# Altium project ADCS_CubeSat_1U.PrjPcb (part 1 of 2)
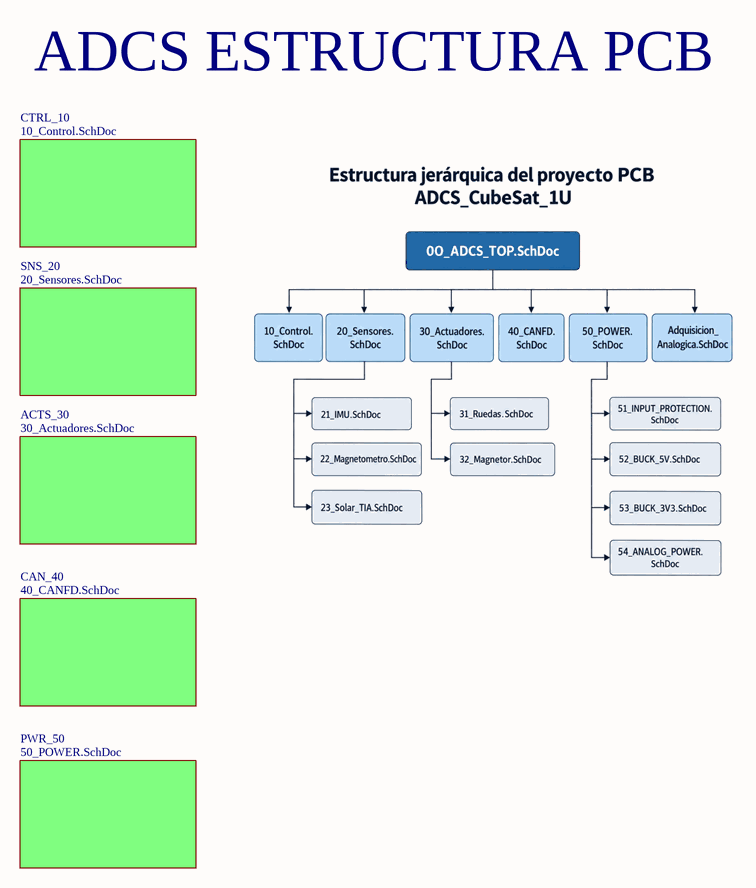
[diagram p0: 00_ADCS_TOP.SchDoc]
16 sheets, 151 parts. Net scope: flat (ports and power ports of the same name join across sheets).
Sheets:
  00_ADCS_TOP.SchDoc
    CTRL_10 = 10_Control.SchDoc
    SNS_20 = 20_Sensores.SchDoc
      SS21 = 21_IMU.SchDoc
      SS22 = 22_Magnetometro.SchDoc
      SS23 = 23_Solar_TIA.SchDoc
    ACTS_30 = 30_Actuadores.SchDoc
      ACTS31 = 31_Ruedas.SchDoc
      ACTS32 = 32_Magnetor.SchDoc
    CAN_40 = 40_CANFD.SchDoc
    PWR_50 = 50_POWER.SchDoc
      PWR51 = 51_INPUT_PROTECTION.SchDoc
      PWR52 = 52_BUCK_5V.SchDoc
      PWR53 = 53_BUCK_3V3.SchDoc
      PWR54 = 54_ANALOG_POWER.SchDoc
  Adquicision_Analogica.SchDoc

## Sheet 00_ADCS_TOP.SchDoc
size A4; SheetNumber: 1; SheetTotal: 16

### Sub-sheets
ACTS_30 = 30_Actuadores.SchDoc: no entries
CAN_40 = 40_CANFD.SchDoc: no entries
CTRL_10 = 10_Control.SchDoc: no entries
PWR_50 = 50_POWER.SchDoc: no entries
SNS_20 = 20_Sensores.SchDoc: no entries

### Notes on the sheet
- ADCS ESTRUCTURA PCB

## Sheet 10_Control.SchDoc
size A4; SheetNumber: 15; SheetTotal: 16
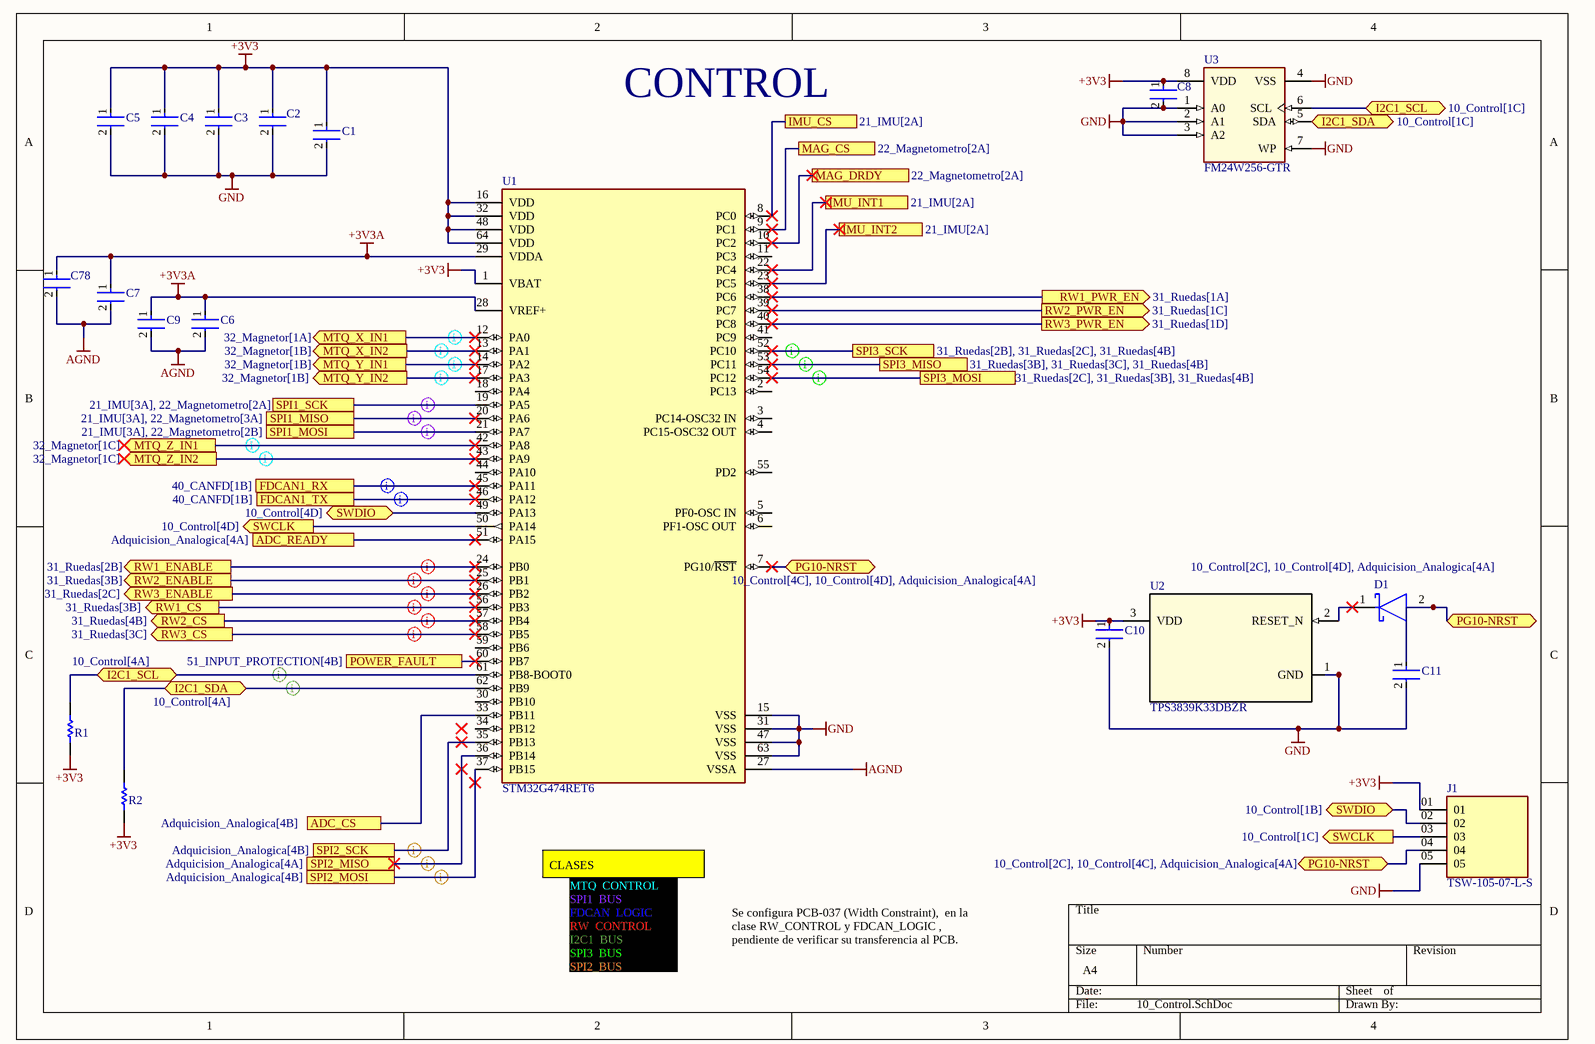
[diagram p1: 10_Control.SchDoc]

### Parts
C1  CC0603KRX7R7BB104  [FP-CC0603-DA-IPC_B]  (value not drawn)
C2  CC0603KRX7R7BB104  [FP-CC0603-DA-IPC_B]  (value not drawn)
C3  CC0603KRX7R7BB104  [FP-CC0603-DA-IPC_B]  (value not drawn)
C4  CC0603KRX7R7BB104  [FP-CC0603-DA-IPC_B]  (value not drawn)
C5  CC0805KKX7R6BB475  [FP-CC0805-0_85-IPC_C]  (value not drawn)
C6  CC0603KRX7R7BB104  [FP-CC0603-DA-IPC_B]  (value not drawn)
C7  CC0603KRX7R6BB105  [FP-CC0603-DA-IPC_B]  (value not drawn)
C8  CC0603KRX7R7BB104  [FP-CC0603-DA-IPC_B]  (value not drawn)
C9  CC0603KRX7R6BB105  [FP-CC0603-DA-IPC_B]  (value not drawn)
C10  CC0603KRX7R7BB104  [FP-CC0603-DA-IPC_B]  (value not drawn)
C11  CC0603KRX7R7BB104  [FP-CC0603-DA-IPC_B]  (value not drawn)
C78  C0603C103K3RACTU  [FP-C0603C-CF-IPC_B]  (value not drawn)
D1  BAT54J,115  [FP-SOD323F-MFG]  (value not drawn)
J1  TSW-105-07-L-S  [SAMTEC_TSW-105-07-L-S]
R1  RC0603FR-074K7L  [RESC1608X55X25NL10T15]  (value not drawn)
R2  RC0603FR-074K7L  [RESC1608X55X25NL10T15]  (value not drawn)
U1  STM32G474RET6  [FP-LQFP64-5W-IPC_C]
U2  TPS3839K33DBZR  [DBZ0003A_N]
U3  FM24W256-GTR  [SOIC127P602X173-8N-1-V]

### Ports
ADC_CS (see Adquicision_Analogica[4B]), ADC_READY (see Adquicision_Analogica[4A]), FDCAN1_RX (see 40_CANFD[1B]), FDCAN1_TX (see 40_CANFD[1B]), I2C1_SCL (bidir, see 10_Control[1C]), I2C1_SCL (bidir, see 10_Control[4A]), I2C1_SDA (bidir, see 10_Control[1C]), I2C1_SDA (bidir, see 10_Control[4A]), IMU_CS (see 21_IMU[2A]), IMU_INT1 (see 21_IMU[2A]), IMU_INT2 (see 21_IMU[2A]), MAG_CS (see 22_Magnetometro[2A]), MAG_DRDY (see 22_Magnetometro[2A]), MTQ_X_IN1 (out, see 32_Magnetor[1A]), MTQ_X_IN2 (out, see 32_Magnetor[1B]), MTQ_Y_IN1 (out, see 32_Magnetor[1B]), MTQ_Y_IN2 (out, see 32_Magnetor[1B]), MTQ_Z_IN1 (out, see 32_Magnetor[1C]), MTQ_Z_IN2 (out, see 32_Magnetor[1C]), PG10-NRST (bidir, see 10_Control[2C], 10_Control[4C], Adquicision_Analogica[4A]), PG10-NRST (bidir, see 10_Control[2C], 10_Control[4D], Adquicision_Analogica[4A]), PG10-NRST (bidir, see 10_Control[4C], 10_Control[4D], Adquicision_Analogica[4A]), POWER_FAULT (see 51_INPUT_PROTECTION[4B]), RW1_CS (out, see 31_Ruedas[3B]), RW1_ENABLE (out, see 31_Ruedas[2B]), RW1_PWR_EN (out, see 31_Ruedas[1A]), RW2_CS (out, see 31_Ruedas[4B]), RW2_ENABLE (out, see 31_Ruedas[3B]), RW2_PWR_EN (out, see 31_Ruedas[1C]), RW3_CS (out, see 31_Ruedas[3C]), RW3_ENABLE (out, see 31_Ruedas[2C]), RW3_PWR_EN (out, see 31_Ruedas[1D]), SPI1_MISO (see 21_IMU[3A], 22_Magnetometro[3A]), SPI1_MOSI (see 21_IMU[3A], 22_Magnetometro[2B]), SPI1_SCK (see 21_IMU[3A], 22_Magnetometro[2A]), SPI2_MISO (see Adquicision_Analogica[4A]), SPI2_MOSI (see Adquicision_Analogica[4B]), SPI2_SCK (see Adquicision_Analogica[4B]), SPI3_MISO (see 31_Ruedas[3B], 31_Ruedas[3C], 31_Ruedas[4B]), SPI3_MOSI (see 31_Ruedas[2C], 31_Ruedas[3B], 31_Ruedas[4B]), SPI3_SCK (see 31_Ruedas[2B], 31_Ruedas[2C], 31_Ruedas[4B]), SWCLK (out, see 10_Control[1C]), SWCLK (out, see 10_Control[4D]), SWDIO (bidir, see 10_Control[1B]), SWDIO (bidir, see 10_Control[4D])

### Nets
+3V3: C1.1 C2.1 C3.1 C4.1 C5.1 C8.1 C10.1 J1.01 R1.1 R2.1 U1.1(VBAT) U1.16(VDD) U1.32(VDD) U1.48(VDD) U1.64(VDD) U2.3(VDD) U3.8(VDD)
+3V3A: C6.1 C7.1 C9.1 C78.1 U1.28(VREF+) U1.29(VDDA)
AGND: C6.2 C7.2 C9.2 C78.2 U1.27(VSSA)
GND: C1.2 C2.2 C3.2 C4.2 C5.2 C8.2 C10.2 C11.2 J1.05 U1.15(VSS) U1.31(VSS) U1.47(VSS) U1.63(VSS) U2.1(GND) U3.1(A0) U3.2(A1) U3.3(A2) U3.4(VSS) U3.7(WP)
NetC11_1: C11.1 D1.2(A) J1.04 U1.7(PG10/~{RST}) ; port PG10-NRST
NetD1_1: D1.1(C) U2.2(RESET_N)
NetJ1_02: J1.02 U1.49(PA13) ; port SWDIO
NetJ1_03: J1.03 U1.50(PA14) ; port SWCLK
NetJ2_2: U1.24(PB0) ; port RW1_ENABLE
NetJ2_3: U1.53(PC11) ; port SPI3_MISO
NetJ2_4: U1.54(PC12) ; port SPI3_MOSI
NetJ2_5: U1.52(PC10) ; port SPI3_SCK
NetJ2_6: U1.56(PB3) ; port RW1_CS
NetJ3_2: U1.25(PB1) ; port RW2_ENABLE
NetJ3_6: U1.57(PB4) ; port RW2_CS
NetJ4_2: U1.26(PB2) ; port RW3_ENABLE
NetJ4_6: U1.58(PB5) ; port RW3_CS
NetR1_2: R1.2 U1.61(PB8-BOOT0) U3.6(SCL) ; port I2C1_SCL
NetR2_2: R2.2 U1.62(PB9) U3.5(SDA) ; port I2C1_SDA
NetR18_1: U1.38(PC6) ; port RW1_PWR_EN
NetR19_1: U1.39(PC7) ; port RW2_PWR_EN
NetR20_1: U1.40(PC8) ; port RW3_PWR_EN
NetR35_1: U1.60(PB7) ; port POWER_FAULT
NetU1_8: U1.8(PC0) ; port IMU_CS
NetU1_9: U1.9(PC1) ; port MAG_CS
NetU1_10: U1.10(PC2) ; port MAG_DRDY
NetU1_12: U1.12(PA0) ; port MTQ_X_IN1
NetU1_13: U1.13(PA1) ; port MTQ_X_IN2
NetU1_14: U1.14(PA2) ; port MTQ_Y_IN1
NetU1_17: U1.17(PA3) ; port MTQ_Y_IN2
NetU1_19: U1.19(PA5) ; port SPI1_SCK
NetU1_20: U1.20(PA6) ; port SPI1_MISO
NetU1_21: U1.21(PA7) ; port SPI1_MOSI
NetU1_22: U1.22(PC4) ; port IMU_INT1
NetU1_23: U1.23(PC5) ; port IMU_INT2
NetU1_33: U1.33(PB11) ; port ADC_CS
NetU1_35: U1.35(PB13) ; port SPI2_SCK
NetU1_36: U1.36(PB14) ; port SPI2_MISO
NetU1_37: U1.37(PB15) ; port SPI2_MOSI
NetU1_42: U1.42(PA8) ; port MTQ_Z_IN1
NetU1_43: U1.43(PA9) ; port MTQ_Z_IN2
NetU1_45: U1.45(PA11) ; port FDCAN1_RX
NetU1_46: U1.46(PA12) ; port FDCAN1_TX
NetU1_51: U1.51(PA15) ; port ADC_READY

Not connected (* = marked no-connect by the designer): U1 2(PC13) 3(PC14-OSC32_IN) 4(PC15-OSC32_OUT) 5(PF0-OSC_IN) 6(PF1-OSC_OUT) 11(PC3) 18(PA4) 30(PB10) 34(PB12) 41(PC9) 44(PA10) 55(PD2) 59(PB6)

### Layout directives
net class SPI3_BUS: NetJ2_3, NetJ2_4, NetJ2_5
net class RW_CONTROL; rule Width Constraint [Pref Width = 9.842mil    Min Width = 7.874mil    Max Width = 39.37mil]: NetJ2_2
net class RW_CONTROL: NetJ2_6, NetJ3_2, NetJ3_6, NetJ4_2, NetJ4_6
net class MTQ_CONTROL: NetU1_12, NetU1_13, NetU1_14, NetU1_17, NetU1_42, NetU1_43
net class SPI1_BUS: NetU1_19, NetU1_20, NetU1_21
net class SPI2_BUS: NetU1_35, NetU1_36, NetU1_37
net class FDCAN_LOGIC; rule Width Constraint [Pref Width = 9.842mil    Min Width = 7.874mil    Max Width = 39.37mil]: NetU1_45
net class FDCAN_LOGIC: NetU1_46
net class I2C1_BUS: NetR1_2, NetR2_2

### Notes on the sheet
- CONTROL
- CLASES
- MTQ_CONTROL
- SPI1_BUS
- FDCAN_LOGIC
- RW_CONTROL
- I2C1_BUS
- SPI3_BUS
- SPI2_BUS
- Se configura PCB-037 (Width Constraint),  en la clase RW_CONTROL y FDCAN_LOGIC , pendiente de verificar su transferencia al PCB.

### Library data of the parts
C1-C4 C6 C8 C10 C11 = CMP-2000-05002-2: CAP CER 0.1UF 16V X7R 0603; Manufacturer: YAGEO; Tolerance: 0.1; Value: 100 nF; Temperature Coefficient: 15%; Material: Ceramic; Voltage Rating: 16 V; Package: CC0603-DA; ComponentLink2Description: Datasheet; Octopart: https://octopart.com/cc0603krx7r7bb104-yageo-192941; Temperature Range High: +125°C; Digikey Description: CAP CER 0.1UF 16V X7R 0603; Voltage: 16 V; Device Class L2: Capacitors; Height: 0.9mm; Temperature: -55°C to +125°C; Manufacturer Part Number: CC0603KRX7R7BB104; Device Class L1: Passive Components; Device Class L3: Ceramic Capacitors; ComponentLink2URL: http://www.yageo.com/documents/recent/UPY-GPHC_X7R_6.3V-to-50V_18.pdf; Footprint Url: http://www.yageo.com/exep/pages/download/literatures/UPY-C_GEN_24.pdf; RoHS: TRUE; Temperature Range Low: -55°C; Temperature Characteristic: X7R; Lead Free: Yes; Capacitance: 100 nF; Category: Cap; Mouser Description: Multilayer Ceramic Capacitor, CC Series, 0.1 - F, - 10%, X7R, 16 V, 0603 [1608 Metric]; Automotive: No
C5 = CMP-03422-001180-1: CAP CER 4.7UF 10V X7R 0805; Manufacturer: Yageo; Tolerance: 0.1; Material: Ceramic; ComponentLink2Description: Datasheet; ComponentLink2URL: http://www.yageo.com/documents/recent/UPY-GPHC_Y5V_6.3V-to-50V_8.pdf; Capacitance: 4.7 uF; Mouser Description: 0805 4.7 uF 10 V ±10% Tolerance X7R SMT Multilayer Ceramic Capacitor; Automotive: No; Value: 4.7 uF; Height: 0.95mm; Temperature: -30°C to +85°C; Temperature Range High: +85°C; Octopart: https://octopart.com/cc0805kkx7r6bb475-yageo-11543698; Footprint Url: http://www.yageo.com/exep/pages/download/literatures/UPY-C_GEN_24.pdf; Voltage Rating: 10 V; Temperature Range Low: -30°C; Lead Free: Yes; Device Class L3: Ceramic Capacitors; Digikey Description: CAP CER 4.7UF 10V X7R 0805; Temperature Characteristic: X7R; Category: Cap; Package: CC0805-0.85; Manufacturer Part Number: CC0805KKX7R6BB475; Device Class L1: Passive Components; Ipc Land Pattern Name: CAPC200125X85; RoHS: TRUE; Device Class L2: Capacitors
C7 C9 = CMP-03422-000835-1: CAP CER 1UF 10V X7R 0603; Manufacturer: YAGEO; Material: Ceramic; Temperature Coefficient: 15%; Tolerance: 0.1; Digikey Description: CAP CER 1UF 10V X7R 0603; Temperature: -55°C to +125°C; ComponentLink2URL: http://www.yageo.com/documents/recent/UPY-GPHC_X7R_6.3V-to-50V_18.pdf; Category: Cap; Voltage Rating: 10 V; Footprint Url: http://www.yageo.com/exep/pages/download/literatures/UPY-C_GEN_24.pdf; Mouser Description: Multilayer Ceramic Capacitors MLCC - SMD/SMT 1.0uF 10V X7R 10%; Device Class L3: Ceramic Capacitors; Temperature Characteristic: X7R; Automotive: No; Package: CC0603-DA; Temperature Range High: +125°C; Voltage: 10 V; Height: 0.9mm; Device Class L1: Passive Components; ComponentLink2Description: Datasheet; Lead Free: Yes; Octopart: https://octopart.com/cc0603krx7r6bb105-yageo-13184191; Capacitance: 1 uF; Manufacturer Part Number: CC0603KRX7R6BB105; Temperature Range Low: -55°C; RoHS: TRUE; Value: 1 uF; Device Class L2: Capacitors
C78 = CMP-2006-03040-2: CAP CER 10000PF 25V 10% X7R 0603; Manufacturer: KEMET; Material: Ceramic; Capacitance: 10,000 pF; Value: 10,000 pF; Tolerance: 0.1; Automotive Grade: Grade 1; Temperature Coefficient: 30ppm/°C; Lead Free: Yes; Temperature Range High: +125°C; Temperature Characteristic: X7R; Device Class L2: Capacitors; Mouser Description: Multilayer Ceramic Capacitors MLCC - SMD/SMT 25volts 10000pF X7R 10%; ComponentLink2Description: Datasheet; Height: 0.87mm; Digikey Description: CAP CER 10000PF 25V 10% X7R 0603; ComponentLink2URL: https://api.kemet.com/component-edge/download/datasheet/C0603C100J5GACAUTO.pdf; Octopart: https://octopart.com/c0603c103k3ractu-kemet-89103; Category: Cap; Package: C0603C-CF; Voltage Rating: 25 V; Device Class L3: Ceramic Capacitors; Automotive: Yes; RoHS: TRUE; Temperature: -55°C to +125°C; Temperature Range Low: -55°C; Device Class L1: Passive Components; Manufacturer Part Number: C0603C103K3RACTU
D1 = CMP-14398-000037-1: DIODE SCHOTTKY 30V 200MA SOD323F; RoHS Compliant: Yes
J1 = CMP-029-000000-1: MF: Samtec; Price: None; MP: TSW-105-07-L-S; Design Item ID: TSW-105-07-L-S; Package: None; Source: TSW-105-07-L-S.SchLib; Availability: Unavailable; Component Type: Standard; Pin Count: 5; Value: *
R1 R2 = CMP-2000-06942-1: Chip Resistor, 4.7 KOhm, +/- 1%, 0.1 W, -55 to 155 degC, 0603 (1608 Metric), RoHS, Tape and Reel; Manufacturer: Yageo; Power Rating: 100mW; Temperature Coefficient: 100PPM/C; Resistance: 4.7kOhms; Voltage Rating: 50V; Package Reference: 0603; Series: RC; Datasheet Version: Rev. 7, 05/2017; Packaging: Reel; Termination Style: SMD/SMT; Datasheet URL: http://www.yageo.com/documents/recent/PYu-RC_Group_51_RoHS_L_7.pdf; Manufacturer URL: http://www.yageo.com/; Package Description: 2-Pin Surface Mount Device, Body 1.6 x 0.8 mm; Case Code - mm: 1608; Case Code - in: 0603; Mounting Technology: SurfaceMount; Operating Temperature Range: -55Cto+155C; Tolerance: 1%; Product: ThickFilmResistorsGeneralPurpose
U1 = CMP-00030-00001-1: MCU 32-bit ARM Cortex M4 RISC 512KB Flash 1.8V/2.5V/3.3V 64-Pin LQFP Tray; Max Operating Temperature: 85°C; Min Operating Temperature: -40°C; Case/Package: LFQFP
U2 = CMP-022-000000-1: Ultra-low power, supply voltage supervisor 3-SOT-23 -40 to 85; Manufacturer_Name: Texas Instruments; Source: TPS3839K33DBZR.SchLib; RefDes: RefDes; TYPE: TYPE; Design Item ID: TPS3839K33DBZR; Manufacturer_Part_Number: TPS3839K33DBZR; Copyright: Copyright (C) 2025 Ultra Librarian. All rights reserved.
U3 = FM24W256-GTR: 256-Kbit Serial I2C F-RAM; Manufacturer: Infineon Technologies; Manufacturer Order Number: FM24W256-GTR; PackageReference: PG-DSO-8-802

## Sheet 20_Sensores.SchDoc
size A4; SheetNumber: 3; SheetTotal: 6
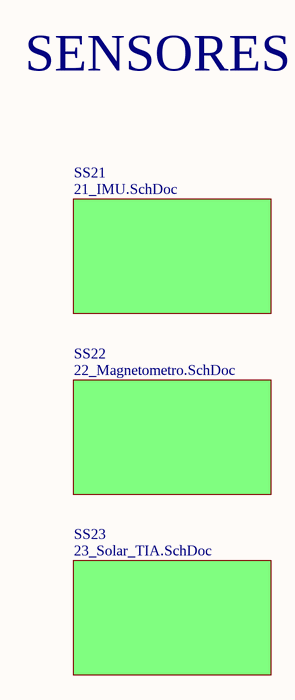
[diagram p2: 20_Sensores.SchDoc]

### Sub-sheets
SS21 = 21_IMU.SchDoc: no entries
SS22 = 22_Magnetometro.SchDoc: no entries
SS23 = 23_Solar_TIA.SchDoc: no entries

### Notes on the sheet
- SENSORES

## Sheet 21_IMU.SchDoc
size A4; SheetNumber: 3; SheetTotal: 16
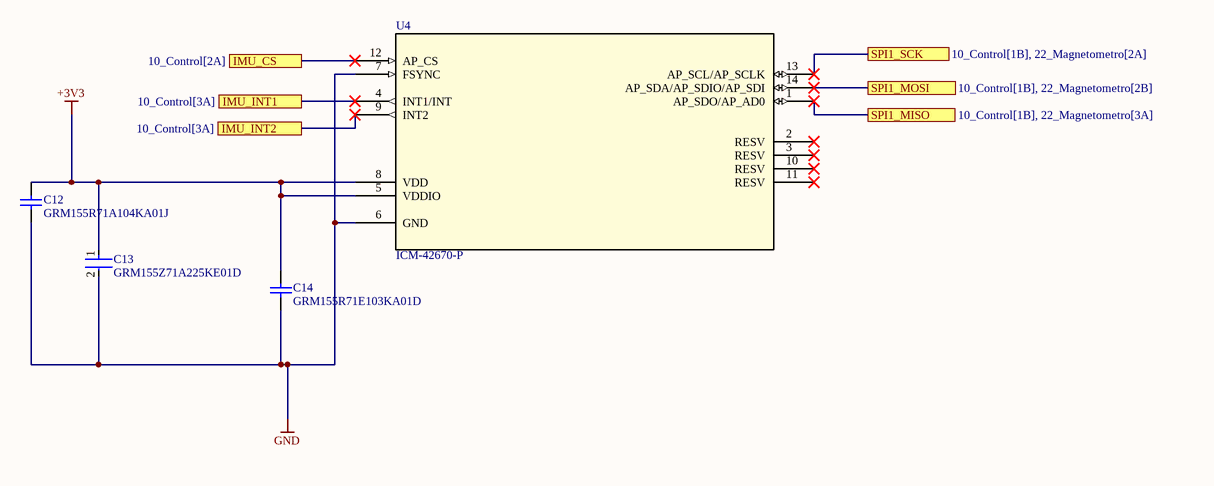
[diagram p3: 21_IMU.SchDoc]

### Parts
C12  GRM155R71A104KA01J  [CAPC1005X55X25ML05T10]
C13  GRM155Z71A225KE01D  [FP-GRM155-0_15-IPC_A]
C14  GRM155R71E103KA01D  [CAPC1005X55X25LL05T10]
U4  ICM-42670-P  [LGA14_2.5X3X0.76_IVS]

### Ports
IMU_CS (see 10_Control[2A]), IMU_INT1 (see 10_Control[3A]), IMU_INT2 (see 10_Control[3A]), SPI1_MISO (see 10_Control[1B], 22_Magnetometro[3A]), SPI1_MOSI (see 10_Control[1B], 22_Magnetometro[2B]), SPI1_SCK (see 10_Control[1B], 22_Magnetometro[2A])

### Nets
+3V3: C12.2 C13.1 C14.2 U4.5(VDDIO) U4.8(VDD)
GND: C12.1 C13.2 C14.1 U4.6(GND) U4.7(FSYNC)
NetU1_8: U4.12(AP_CS) ; port IMU_CS
NetU1_19: U4.13(AP_SCL/AP_SCLK) ; port SPI1_SCK
NetU1_20: U4.1(AP_SDO/AP_AD0) ; port SPI1_MISO
NetU1_21: U4.14(AP_SDA/AP_SDIO/AP_SDI) ; port SPI1_MOSI
NetU1_22: U4.4(INT1/INT) ; port IMU_INT1
NetU1_23: U4.9(INT2) ; port IMU_INT2

Not connected (* = marked no-connect by the designer): U4 2(RESV)* 3(RESV)* 10(RESV)* 11(RESV)*

### Library data of the parts
C12 = CMP-2008-04031-1: Manufacturer: Murata; Part Number: GRM155R71A104KA01J
C13 = CMP-06035-048202-1: Chip Multilayer Ceramic Capacitors for General Purpose, 0402, 2.2uF, X7R, 15%, 10%, 10V
C14 = CMP-1034-01880-2: Manufacturer: Murata; Part Number: GRM155R71E103KA01D
U4 = ICM-42670-P: Description; Manufacturer_Name: TDK; Copyright: Copyright (C) 2026 Ultra Librarian. All rights reserved.; Manufacturer_Part_Number: ICM-42670-P; RefDes: RefDes; Type: Type

## Sheet 22_Magnetometro.SchDoc
size A4; SheetNumber: 4; SheetTotal: 16
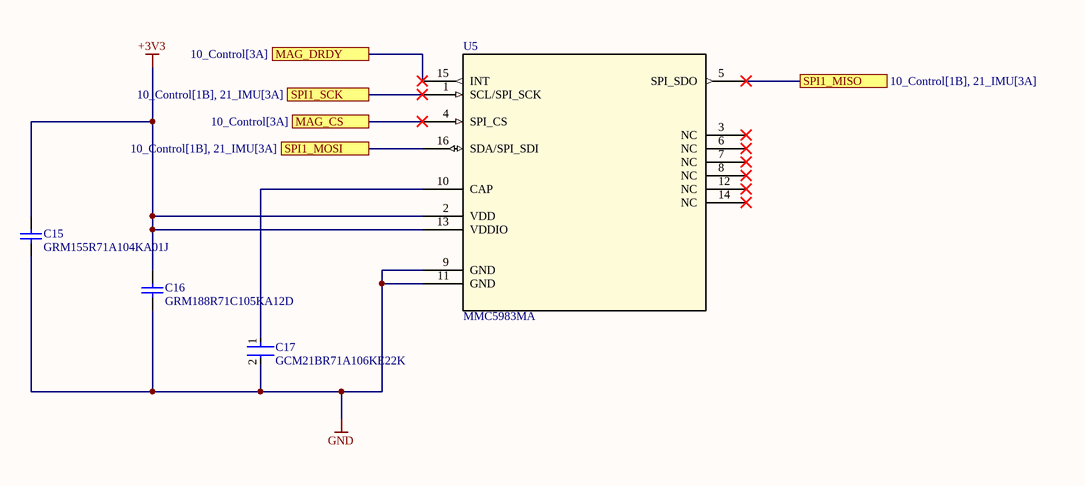
[diagram p4: 22_Magnetometro.SchDoc]

### Parts
C15  GRM155R71A104KA01J  [CAPC1005X55X25ML05T10]
C16  GRM188R71C105KA12D  [CAPC1608X90X35ML10T15]
C17  GCM21BR71A106KE22K  [FP-GCM21B-0_15-MFG]
U5  MMC5983MA  [MMC5983MA_MEM]

### Ports
MAG_CS (see 10_Control[3A]), MAG_DRDY (see 10_Control[3A]), SPI1_MISO (see 10_Control[1B], 21_IMU[3A]), SPI1_MOSI (see 10_Control[1B], 21_IMU[3A]), SPI1_SCK (see 10_Control[1B], 21_IMU[3A])

### Nets
+3V3: C15.2 C16.2 U5.2(VDD) U5.13(VDDIO)
GND: C15.1 C16.1 C17.2 U5.9(GND) U5.11(GND)
NetC17_1: C17.1 U5.10(CAP)
NetU1_9: U5.4(SPI_CS) ; port MAG_CS
NetU1_10: U5.15(INT) ; port MAG_DRDY
NetU1_19: U5.1(SCL/SPI_SCK) ; port SPI1_SCK
NetU1_20: U5.5(SPI_SDO) ; port SPI1_MISO
NetU1_21: U5.16(SDA/SPI_SDI) ; port SPI1_MOSI

Not connected (* = marked no-connect by the designer): U5 3(NC)* 6(NC)* 7(NC)* 8(NC)* 12(NC)* 14(NC)*

### Library data of the parts
C15 = CMP-2008-04031-1: Manufacturer: Murata; Part Number: GRM155R71A104KA01J
C16 = CMP-2006-02845-1: Manufacturer: Murata; Part Number: GRM188R71C105KA12D
C17 = CMP-06035-062139-1: Ceramic Capacitor for Automotive 10uF ±10% 10VDC X7R 0805 Embossed T/R; Voltage Rating: 10V; Mount: Surface Mount; Max Operating Temperature: 125°C; Tolerance: 10%; Voltage Rating (DC): 10V; Dielectric: X7R; RoHS Compliant: Yes; Package Quantity: 10000; Min Operating Temperature: -55°C; Case/Package: 0805; Case Code (Imperial): 0805; Thickness: 0.055inch; Weight: 0.000335oz; Length: 0.079inch; Ratings: AEC-Q200; Case Code (Metric): 2012; Termination: SMD/SMT; Width: 1.25mm; Height: 1.25mm; Packaging: Tape and Reel; Capacitance: 10uF
U5 = MMC5983MA: Description; Manufacturer_Name: Memsic; Copyright: Copyright (C) 2025 Ultra Librarian. All rights reserved.; Manufacturer_Part_Number: MMC5983MA; RefDes: RefDes; Type: Type

## Sheet 23_Solar_TIA.SchDoc
size A4; SheetNumber: 5; SheetTotal: 16
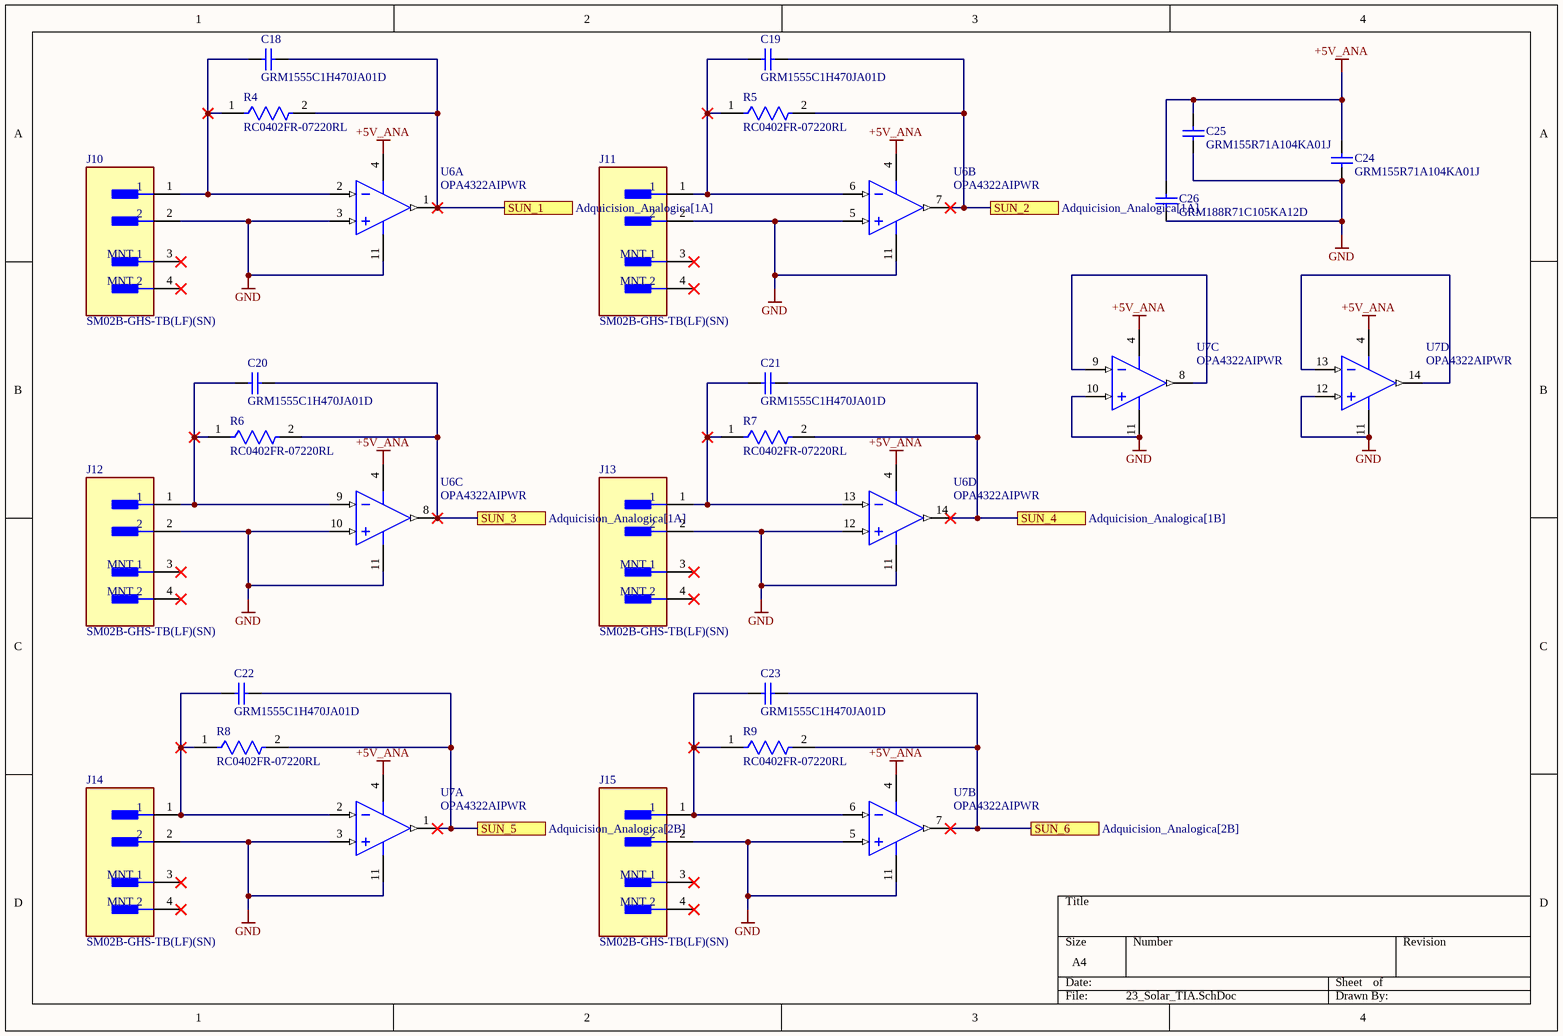
[diagram p5: 23_Solar_TIA.SchDoc]

### Parts
C18  GRM1555C1H470JA01D  [CAPC1005X55X25LL05T10]
C19  GRM1555C1H470JA01D  [CAPC1005X55X25LL05T10]
C20  GRM1555C1H470JA01D  [CAPC1005X55X25LL05T10]
C21  GRM1555C1H470JA01D  [CAPC1005X55X25LL05T10]
C22  GRM1555C1H470JA01D  [CAPC1005X55X25LL05T10]
C23  GRM1555C1H470JA01D  [CAPC1005X55X25LL05T10]
C24  GRM155R71A104KA01J  [CAPC1005X55X25ML05T10]
C25  GRM155R71A104KA01J  [CAPC1005X55X25ML05T10]
C26  GRM188R71C105KA12D  [CAPC1608X90X35ML10T15]
J10  SM02B-GHS-TB(LF)(SN)  [FP-SM02B-GHS-TB_LF_SN-MFG]
J11  SM02B-GHS-TB(LF)(SN)  [FP-SM02B-GHS-TB_LF_SN-MFG]
J12  SM02B-GHS-TB(LF)(SN)  [FP-SM02B-GHS-TB_LF_SN-MFG]
J13  SM02B-GHS-TB(LF)(SN)  [FP-SM02B-GHS-TB_LF_SN-MFG]
J14  SM02B-GHS-TB(LF)(SN)  [FP-SM02B-GHS-TB_LF_SN-MFG]
J15  SM02B-GHS-TB(LF)(SN)  [FP-SM02B-GHS-TB_LF_SN-MFG]
R4  RC0402FR-07220RL  [FP-RC0402-0_4-MFG]
R5  RC0402FR-07220RL  [FP-RC0402-0_4-MFG]
R6  RC0402FR-07220RL  [FP-RC0402-0_4-MFG]
R7  RC0402FR-07220RL  [FP-RC0402-0_4-MFG]
R8  RC0402FR-07220RL  [FP-RC0402-0_4-MFG]
R9  RC0402FR-07220RL  [FP-RC0402-0_4-MFG]
U6  OPA4322AIPWR  [PW0014A_N]  (parts A,B,C,D of 4)
U7  OPA4322AIPWR  [PW0014A_N]  (parts A,B,C,D of 4)

### Ports
SUN_1 (see Adquicision_Analogica[1A]), SUN_2 (see Adquicision_Analogica[1A]), SUN_3 (see Adquicision_Analogica[1A]), SUN_4 (see Adquicision_Analogica[1B]), SUN_5 (see Adquicision_Analogica[2B]), SUN_6 (see Adquicision_Analogica[2B])

### Nets
+5V_ANA: C24.2 C25.2 C26.2 U6.4(V+) U7.4(V+)
GND: C24.1 C25.1 C26.1 J10.2 J11.2 J12.2 J13.2 J14.2 J15.2 U6.3(IN_A+) U6.5(IN_B+) U6.10(IN_C+) U6.11(V-) U6.12(IN_D+) U7.3(IN_A+) U7.5(IN_B+) U7.10(IN_C+) U7.11(V-) U7.12(IN_D+)
NetC18_1: C18.1 J10.1 R4.1 U6.2(IN_A-)
NetC18_2: C18.2 R4.2 U6.1(OUT_A) ; port SUN_1
NetC19_1: C19.1 J11.1 R5.1 U6.6(IN_B-)
NetC19_2: C19.2 R5.2 U6.7(OUT_B) ; port SUN_2
NetC20_1: C20.1 J12.1 R6.1 U6.9(IN_C-)
NetC20_2: C20.2 R6.2 U6.8(OUT_C) ; port SUN_3
NetC21_1: C21.1 J13.1 R7.1 U6.13(IN_D-)
NetC21_2: C21.2 R7.2 U6.14(OUT_D) ; port SUN_4
NetC22_1: C22.1 J14.1 R8.1 U7.2(IN_A-)
NetC22_2: C22.2 R8.2 U7.1(OUT_A) ; port SUN_5
NetC23_1: C23.1 J15.1 R9.1 U7.6(IN_B-)
NetC23_2: C23.2 R9.2 U7.7(OUT_B) ; port SUN_6
NetU7_8: U7.8(OUT_C) U7.9(IN_C-)
NetU7_13: U7.13(IN_D-) U7.14(OUT_D)

Not connected (* = marked no-connect by the designer): J10 3(MNT_1)* 4(MNT_2)*; J11 3(MNT_1)* 4(MNT_2)*; J12 3(MNT_1)* 4(MNT_2)*; J13 3(MNT_1)* 4(MNT_2)*; J14 3(MNT_1)* 4(MNT_2)*; J15 3(MNT_1)* 4(MNT_2)*

### Library data of the parts
C18-C23 = CMP-2008-04368-1: Manufacturer: Murata; Part Number: GRM1555C1H470JA01D
C24 C25 = CMP-2008-04031-1: Manufacturer: Murata; Part Number: GRM155R71A104KA01J
C26 = CMP-2006-02845-1: Manufacturer: Murata; Part Number: GRM188R71C105KA12D
J10-J15 = CMP-2000-07076-2: CONN HEADER SMD R/A 2POS 1.25MM; Voltage Rating: 50V; Number of Positions: 2; Pitch: 0.049inch; Current Rating: 1A; Connector Type: Outer Shroud Contact; Number of Rows: 1; Contact Material: Bronze; Termination: Solder; Color: Natural; Package Quantity: 2500; Mount: Surface Mount; Housing Color: Natural; Number of Contacts: 2; Packaging: Tape and Reel; Lead Free: Lead Free; Housing Material: Nylon; Orientation: Right Angle; Contact Type: Male Pin; Contact Plating: Tin; Series: GH; Fastening Type: Latch
R4-R9 = CMP-2002-07511-2: NexarPartId: 39818460; Tolerance: 1%; Voltage Rating (AC): 50V; Max Power Dissipation: 63mW; Temperature Coefficient: 100ppm/°C; Power Rating: 62.5mW; Resistance: 220Ω; Voltage Rating (DC): 50V; Voltage Rating: 50V; Schedule B: 8533210045, 8533210045; Min Operating Temperature: -55°C; Termination: SMD/SMT; Lead Free: Lead Free; Width: 500µm; Military Standard: Not; Features: Moisture Resistant; Case/Package: 0402; Max Operating Temperature: 155°C; Height: 350µm; Number of Pins: 2; Depth: 500µm; REACH SVHC: No SVHC; Number of Terminations: 2; Composition: Thick Film; Packaging: Tape & Reel; Length: 1mm; Case Code (Imperial): 0402; RoHS: Compliant
U6 U7 = CMP-0272-01739-3: 20 MHz, Low Noise, RRIO, CMOS Operational Amplifier, 1.8 to 5.5 V, -40 to 125 degC, 14-pin SOP (PW14), Green (RoHS & no Sb/Br); Manufacturer: Texas Instruments; Sub Family: High Output Current Amplifier (>=50mA), Low Input Bias Current Amp (<=10pA), Low Noise Amp (<=10nV/rtHz), Low Supply Voltage Amplifier (<=2.7V), Precision Amplifier; Vio (25C)(Max)(mV): 2; IIB(Max)(pA): 10; Total Supply Voltage(Max)(+5V is 5, +/-5V is 10): 5.5; Iq per channel(Max)(mA): 1.65; Total Supply Voltage(Min)(+5V is 5, +/-5V is 10): 1.8; Rating: Catalog; CMRR(Min)(dB): 90; Packing: LARGE T&R; Number of Channels: 4; GBW(Typ)(MHz): 20; ComponentLink2URL: http://www.ti.com/lit/ds/symlink/opa4322.pdf; ComponentLink1URL: http://www.ti.com/; ComponentLink2Description: Datasheet; ComponentLink3URL: http://www.ti.com/litv/pdf/mpds360; PackageReference: PW0014A; Mounting Technology: Surface Mount; PartNumber: OPA4322AIPWR; Eco-Plan: Green (RoHS & no Sb/Br); ComponentLink3Description: Package Specification; ComponentLink1Description: Manufacturer URL; DatasheetVersion: SBOS538E; PackageDescription: 14-Pin Plastic Small Outline, Body 5 x 4.4 mm, Pitch 0.65 mm; PackageVersion: 4040064-3/G, 02/2011; Offset Drift(Typ)(uV/C): 1.8; Slew Rate(Typ)(V/us): 10; Code_JEDEC: MO-153

## Sheet 30_Actuadores.SchDoc
size A4; SheetNumber: 4; SheetTotal: 6
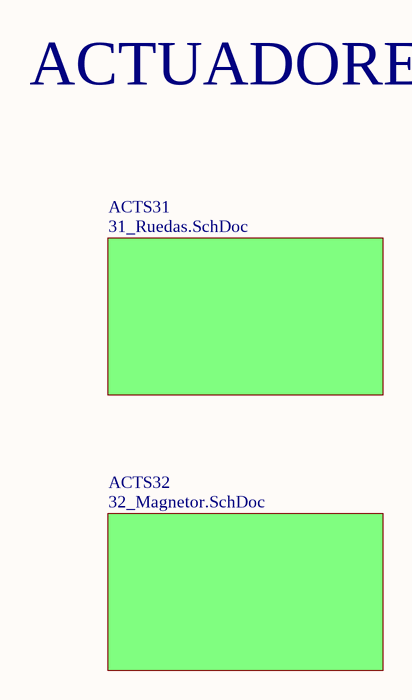
[diagram p6: 30_Actuadores.SchDoc]

### Sub-sheets
ACTS31 = 31_Ruedas.SchDoc: no entries
ACTS32 = 32_Magnetor.SchDoc: no entries

### Notes on the sheet
- ACTUADORES

## Sheet 31_Ruedas.SchDoc
size A4; SheetNumber: 7; SheetTotal: 16
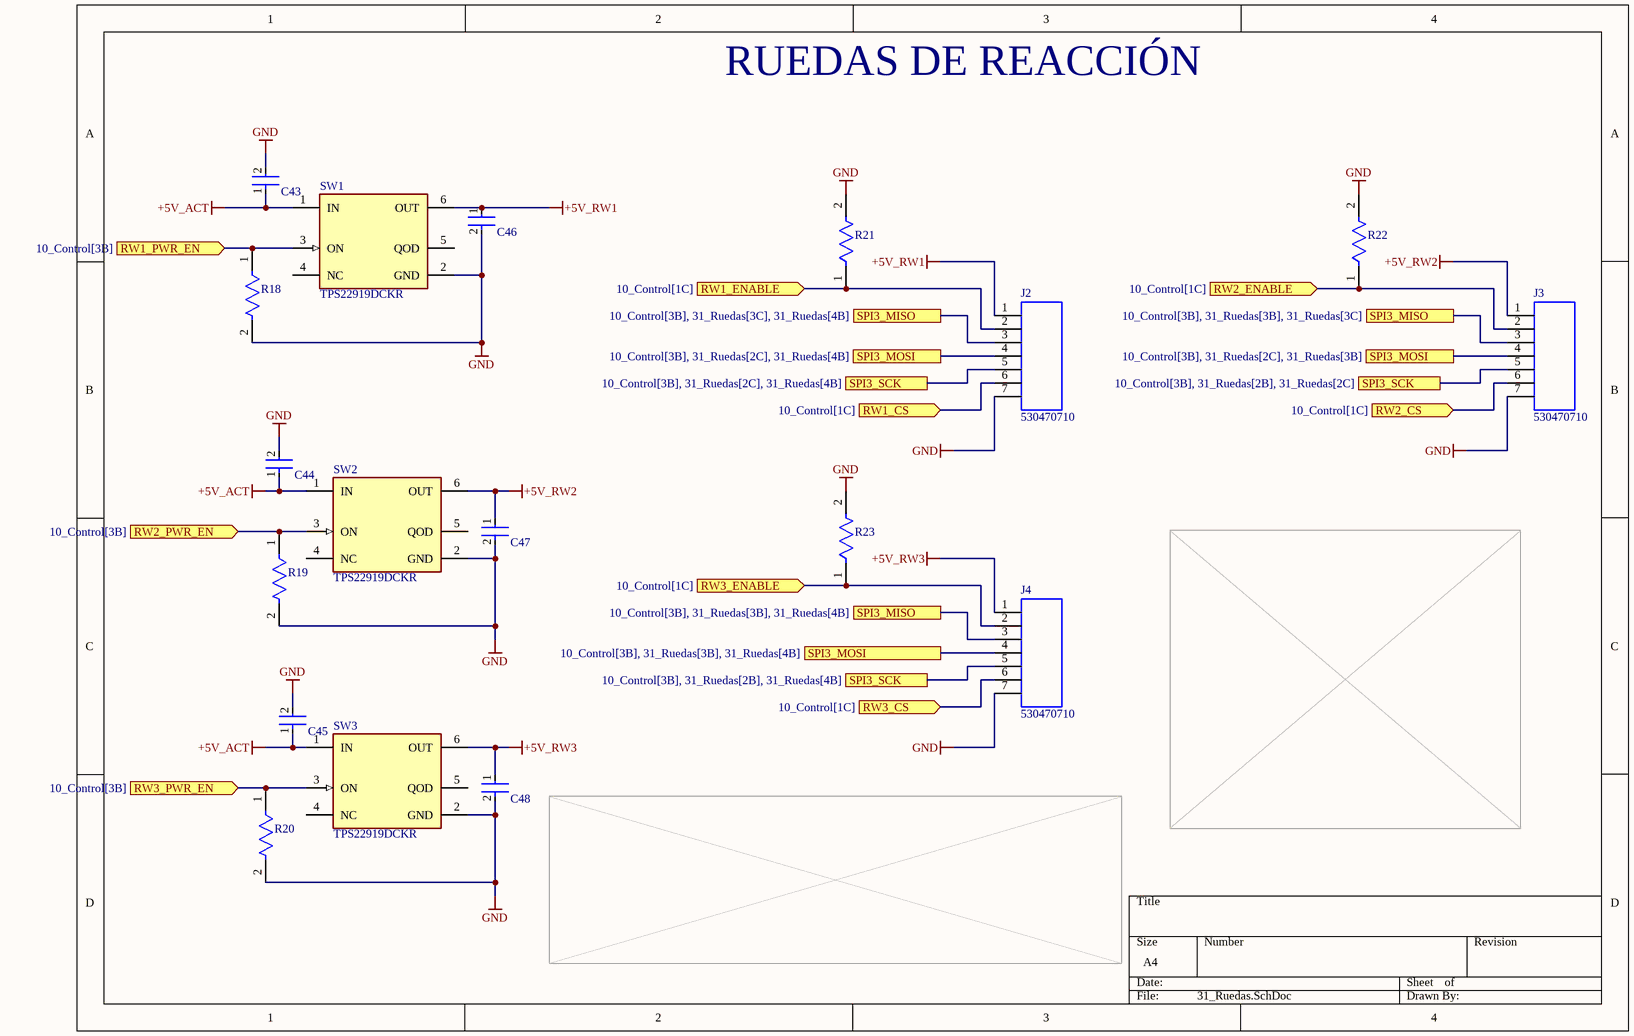
[diagram p7: 31_Ruedas.SchDoc]

### Parts
C43  C0603C104K3RACTU  [FP-C0603C-CF-IPC_B]  (value not drawn)
C44  C0603C104K3RACTU  [FP-C0603C-CF-IPC_B]  (value not drawn)
C45  C0603C104K3RACTU  [FP-C0603C-CF-IPC_B]  (value not drawn)
C46  GCM32ER71E106KA57K  [FP-GCM32E-0_3-IPC_B]  (value not drawn)
C47  GCM32ER71E106KA57K  [FP-GCM32E-0_3-IPC_B]  (value not drawn)
C48  GCM32ER71E106KA57K  [FP-GCM32E-0_3-IPC_B]  (value not drawn)
J2  530470710  [CONN07_530470710_MOL]
J3  530470710  [CONN07_530470710_MOL]
J4  530470710  [CONN07_530470710_MOL]
R18  RC0603FR-07100KL  [FP-RC0603-0_55-MFG]  (value not drawn)
R19  RC0603FR-07100KL  [FP-RC0603-0_55-MFG]  (value not drawn)
R20  RC0603FR-07100KL  [FP-RC0603-0_55-MFG]  (value not drawn)
R21  RC0603FR-07100KL  [FP-RC0603-0_55-MFG]  (value not drawn)
R22  RC0603FR-07100KL  [FP-RC0603-0_55-MFG]  (value not drawn)
R23  RC0603FR-07100KL  [FP-RC0603-0_55-MFG]  (value not drawn)
SW1  TPS22919DCKR  [FP-DCK0006A-IPC_A]
SW2  TPS22919DCKR  [FP-DCK0006A-IPC_A]
SW3  TPS22919DCKR  [FP-DCK0006A-IPC_A]

### Ports
RW1_CS (in, see 10_Control[1C]), RW1_ENABLE (in, see 10_Control[1C]), RW1_PWR_EN (in, see 10_Control[3B]), RW2_CS (in, see 10_Control[1C]), RW2_ENABLE (in, see 10_Control[1C]), RW2_PWR_EN (in, see 10_Control[3B]), RW3_CS (in, see 10_Control[1C]), RW3_ENABLE (in, see 10_Control[1C]), RW3_PWR_EN (in, see 10_Control[3B]), SPI3_MISO (see 10_Control[3B], 31_Ruedas[3B], 31_Ruedas[3C]), SPI3_MISO (see 10_Control[3B], 31_Ruedas[3B], 31_Ruedas[4B]), SPI3_MISO (see 10_Control[3B], 31_Ruedas[3C], 31_Ruedas[4B]), SPI3_MOSI (see 10_Control[3B], 31_Ruedas[2C], 31_Ruedas[3B]), SPI3_MOSI (see 10_Control[3B], 31_Ruedas[2C], 31_Ruedas[4B]), SPI3_MOSI (see 10_Control[3B], 31_Ruedas[3B], 31_Ruedas[4B]), SPI3_SCK (see 10_Control[3B], 31_Ruedas[2B], 31_Ruedas[2C]), SPI3_SCK (see 10_Control[3B], 31_Ruedas[2B], 31_Ruedas[4B]), SPI3_SCK (see 10_Control[3B], 31_Ruedas[2C], 31_Ruedas[4B])

### Nets
+5V_ACT: C43.1 C44.1 C45.1 SW1.1(IN) SW2.1(IN) SW3.1(IN)
+5V_RW1: C46.1 J2.1 SW1.6(OUT)
+5V_RW2: C47.1 J3.1 SW2.6(OUT)
+5V_RW3: C48.1 J4.1 SW3.6(OUT)
GND: C43.2 C44.2 C45.2 C46.2 C47.2 C48.2 J2.7 J3.7 J4.7 R18.2 R19.2 R20.2 R21.2 R22.2 R23.2 SW1.2(GND) SW2.2(GND) SW3.2(GND)
NetJ2_2: J2.2 R21.1 ; port RW1_ENABLE
NetJ2_3: J2.3 J3.3 J4.3 ; port SPI3_MISO
NetJ2_4: J2.4 J3.4 J4.4 ; port SPI3_MOSI
NetJ2_5: J2.5 J3.5 J4.5 ; port SPI3_SCK
NetJ2_6: J2.6 ; port RW1_CS
NetJ3_2: J3.2 R22.1 ; port RW2_ENABLE
NetJ3_6: J3.6 ; port RW2_CS
NetJ4_2: J4.2 R23.1 ; port RW3_ENABLE
NetJ4_6: J4.6 ; port RW3_CS
NetR18_1: R18.1 SW1.3(ON) ; port RW1_PWR_EN
NetR19_1: R19.1 SW2.3(ON) ; port RW2_PWR_EN
NetR20_1: R20.1 SW3.3(ON) ; port RW3_PWR_EN

Not connected (* = marked no-connect by the designer): SW1 4(NC) 5(QOD); SW2 4(NC) 5(QOD); SW3 4(NC) 5(QOD)

### Notes on the sheet
- RUEDAS DE REACCIÓN

### Library data of the parts
C43-C45 = CMP-2006-03057-2: CAP CER 0.1UF 25V X7R 0603; Manufacturer: KEMET; Value: 0.10 μF; Material: Ceramic; Tolerance: 0.1; Temperature Coefficient: 30ppm/°C; Automotive Grade: Grade 1; Lead Free: Yes; Device Class L3: Ceramic Capacitors; Voltage Rating: 25 V; Manufacturer Part Number: C0603C104K3RACTU; Digikey Description: CAP CER 0.1UF 25V X7R 0603; Mouser Description: Multilayer Ceramic Capacitors MLCC - SMD/SMT 25volts 0.1uF X7R 10%; Package: C0603C-CF; Temperature Range Low: -55°C; Automotive: Yes; Device Class L2: Capacitors; Octopart: https://octopart.com/c0603c104k3ractu-kemet-127541; ComponentLink2Description: Datasheet; ComponentLink2URL: https://api.kemet.com/component-edge/download/datasheet/C0603C100J5GACAUTO.pdf; Temperature Range High: +125°C; RoHS: TRUE; Device Class L1: Passive Components; Category: Cap; Temperature: -55°C to +125°C; Capacitance: 0.10 μF; Height: 0.87mm; Temperature Characteristic: X7R
C46-C48 = CMP-2000-06320-2: Ceramic Capacitor for Automotive 10uF ±10% 25VDC X7R 1210 Embossed T/R; Voltage Rating (DC): 25V; Height: 2.5mm; Ratings: AEC-Q200; Termination: SMD/SMT; Case Code (Imperial): 1210; Packaging: Tape and Reel; Min Operating Temperature: -55°C; Radiation Hardening: No; Mount: Surface Mount; Depth: 2.5mm; Case Code (Metric): 3225; Length: 3.2mm; Tolerance: 10%; Package Quantity: 4000; Width: 0.098inch; Max Operating Temperature: 125°C; Thickness: 0.106inch; Case/Package: 1210; Capacitance: 10uF; Voltage Rating: 25V; Dielectric: X7R
J2-J4 = 530470710: Conn Shrouded Header (4 Sides) HDR 7 POS 1.25mm Solder ST Top Entry Thru-Hole PicoBladeâ„¢ Tray; MF: Molex; SnapEDA_Link: https://www.snapeda.com/parts/530470710/Molex/view-part/?ref=snap; Package: None; Value: *; MP: 530470710; Check_prices: https://www.snapeda.com/parts/530470710/Molex/view-part/?ref=eda
R18-R23 = CMP-2100-03662-2: RES SMD 100K OHM 1% 1/10W 0603; Voltage Rating (DC): 50V; Resistance: 100kR; Max Power Dissipation: 100mW; Temperature Coefficient: 100ppm/°C; Working Voltage: 75V; Length: 1.6mm; Lead Free: Lead Free; Number of Terminations: 2; Packaging: Tape and Reel; Voltage Rating: 50V; Termination: SMD/SMT; Width: 0.8mm; Resistor Type: Thick Film; Resistance Tolerance: 1%; Features: Moisture Resistant; Height: 0.45mm; Construction: Rectangular; Case/Package: 0603; Military Standard: Not; Case Code (Imperial): 0603; Series: RC; Technology: THICK FILM; Depth: 0.8mm; RoHS Compliant: Yes; REACH SVHC: No SVHC; Min Operating Temperature: -55°C; Case Code (Metric): 1608; Max Operating Temperature: 155°C; Power Rating: 100mW; Number of Pins: 2; Tolerance: 1%
SW1-SW3 = CMP-04912-000027-1: POWER MANAGEMENT

## Sheet 32_Magnetor.SchDoc
size A4; SheetNumber: 8; SheetTotal: 16
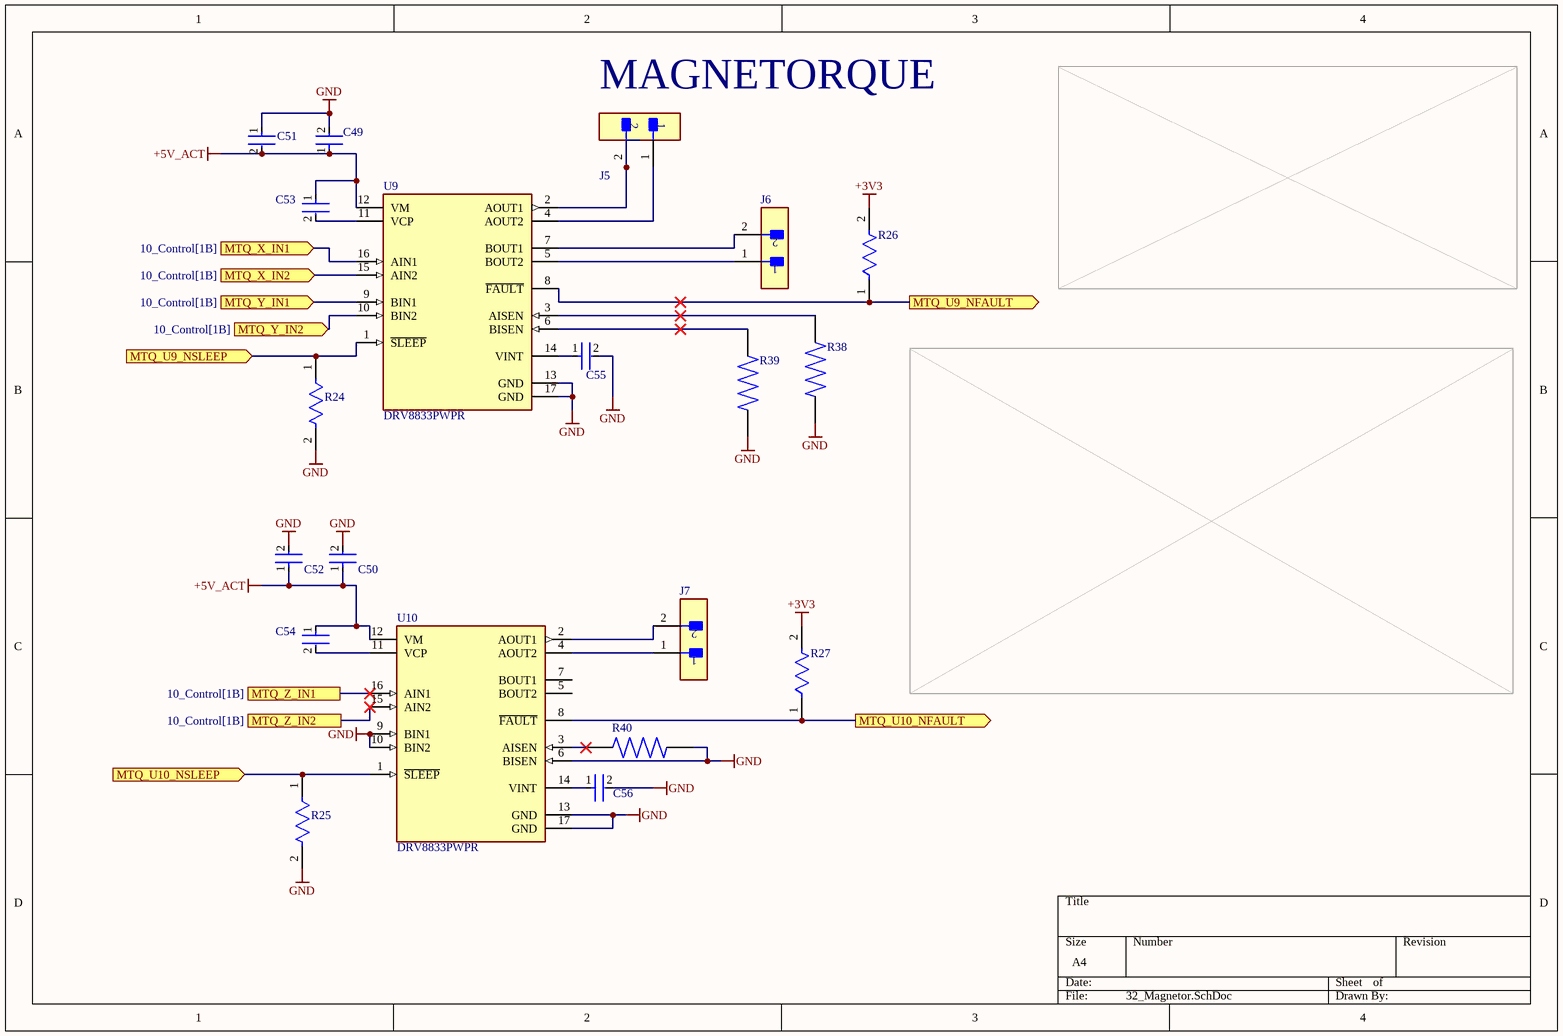
[diagram p8: 32_Magnetor.SchDoc]

### Parts
C49  C0603C104K3RACTU  [FP-C0603C-CF-IPC_B]  (value not drawn)
C50  C0603C104K3RACTU  [FP-C0603C-CF-IPC_B]  (value not drawn)
C51  GRM21BR71A106KA73L  [FP-GRM21B-0_15-MFG]  (value not drawn)
C52  GRM21BR71A106KA73L  [FP-GRM21B-0_15-MFG]  (value not drawn)
C53  C0603C103K3RACTU  [FP-C0603C-CF-IPC_B]  (value not drawn)
C54  C0603C103K3RACTU  [FP-C0603C-CF-IPC_B]  (value not drawn)
C55  GRM188R71A225KE15D  [FP-GRM188-0_1-e0_2_0_5-IPC_A]  (value not drawn)
C56  GRM188R71A225KE15D  [FP-GRM188-0_1-e0_2_0_5-IPC_A]  (value not drawn)
J5  53047-0210  [FP-53047-0210-MFG]  (value not drawn)
J6  53047-0210  [FP-53047-0210-MFG]  (value not drawn)
J7  53047-0210  [FP-53047-0210-MFG]  (value not drawn)
R24  RC0603FR-0747KL  [FP-RC0603FR-0747KL-MFG]  (value not drawn)
R25  RC0603FR-0747KL  [FP-RC0603FR-0747KL-MFG]  (value not drawn)
R26  RC0603FR-0710KL  [FP-RC0603-0_55-IPC_B]  (value not drawn)
R27  RC0603FR-0710KL  [FP-RC0603-0_55-IPC_B]  (value not drawn)
R38  RL1206FR-070R4L  [RESC3116X65N]  (value not drawn)
R39  RL1206FR-070R4L  [RESC3116X65N]  (value not drawn)
R40  RL1206FR-070R4L  [RESC3116X65N]  (value not drawn)
U9  DRV8833PWPR  [FP-PWP0016C-IPC_A]
U10  DRV8833PWPR  [FP-PWP0016C-IPC_A]

### Ports
MTQ_U9_NFAULT (out), MTQ_U9_NSLEEP (in), MTQ_U10_NFAULT (out), MTQ_U10_NSLEEP (in), MTQ_X_IN1 (in, see 10_Control[1B]), MTQ_X_IN2 (in, see 10_Control[1B]), MTQ_Y_IN1 (in, see 10_Control[1B]), MTQ_Y_IN2 (in, see 10_Control[1B]), MTQ_Z_IN1 (see 10_Control[1B]), MTQ_Z_IN2 (see 10_Control[1B])

### Nets
+3V3: R26.2 R27.2
+5V_ACT: C49.1 C50.1 C51.2 C52.1 C53.1 C54.1 U9.12(VM) U10.12(VM)
GND: C49.2 C50.2 C51.1 C52.2 C55.2 C56.2 R24.2 R25.2 R38.1 R39.1 R40.2 U9.13(GND) U9.17(GND) U10.6(BISEN) U10.9(BIN1) U10.10(BIN2) U10.13(GND) U10.17(GND)
NetC53_2: C53.2 U9.11(VCP)
NetC54_2: C54.2 U10.11(VCP)
NetC55_1: C55.1 U9.14(VINT)
NetC56_1: C56.1 U10.14(VINT)
NetJ5_1: J5.1 U9.4(AOUT2)
NetJ5_2: J5.2 U9.2(AOUT1)
NetJ6_1: J6.1 U9.5(BOUT2)
NetJ6_2: J6.2 U9.7(BOUT1)
NetJ7_1: J7.1 U10.4(AOUT2)
NetJ7_2: J7.2 U10.2(AOUT1)
NetR24_1: R24.1 U9.1(~{SLEEP}) ; port MTQ_U9_NSLEEP
NetR25_1: R25.1 U10.1(~{SLEEP}) ; port MTQ_U10_NSLEEP
NetR26_1: R26.1 U9.8(~{FAULT}) ; port MTQ_U9_NFAULT
NetR27_1: R27.1 U10.8(~{FAULT}) ; port MTQ_U10_NFAULT
NetR38_2: R38.2 U9.3(AISEN)
NetR39_2: R39.2 U9.6(BISEN)
NetR40_1: R40.1 U10.3(AISEN)
NetU1_12: U9.16(AIN1) ; port MTQ_X_IN1
NetU1_13: U9.15(AIN2) ; port MTQ_X_IN2
NetU1_14: U9.9(BIN1) ; port MTQ_Y_IN1
NetU1_17: U9.10(BIN2) ; port MTQ_Y_IN2
NetU1_42: U10.16(AIN1) ; port MTQ_Z_IN1
NetU1_43: U10.15(AIN2) ; port MTQ_Z_IN2

Not connected (* = marked no-connect by the designer): U10 5(BOUT2) 7(BOUT1)

### Notes on the sheet
- (near J5) MAGNETORQUE

### Library data of the parts
C49 C50 = CMP-2006-03057-2: as C43 on sheet 31_Ruedas; Lead Free: Yes; Device Class L3: Ceramic Capacitors; Voltage Rating: 25 V; Manufacturer Part Number: C0603C104K3RACTU; Digikey Description: CAP CER 0.1UF 25V X7R 0603; Mouser Description: Multilayer Ceramic Capacitors MLCC - SMD/SMT 25volts 0.1uF X7R 10%; Package: C0603C-CF; Temperature Range Low: -55°C; Automotive: Yes; Device Class L2: Capacitors; Octopart: https://octopart.com/c0603c104k3ractu-kemet-127541; ComponentLink2Description: Datasheet; ComponentLink2URL: https://api.kemet.com/component-edge/download/datasheet/C0603C100J5GACAUTO.pdf; Temperature Range High: +125°C; RoHS: TRUE; Device Class L1: Passive Components; Category: Cap; Temperature: -55°C to +125°C; Capacitance: 0.10 μF; Height: 0.87mm; Temperature Characteristic: X7R
C51 C52 = CMP-2000-07555-2: Chip Multilayer Ceramic Capacitors for General Purpose, 0805, 10uF, X7R, 15%, 10%, 10V; Length: 2mm; Case Code (Metric): 2012; Height: 1.25mm; Tolerance: 10%; Width: 1.25mm; Voltage Rating: 10V; Voltage Rating (DC): 10V; Case/Package: 0805; Package Quantity: 3000; Capacitance: 10uF; REACH SVHC: No SVHC; Case Code (Imperial): 0805; Min Operating Temperature: -55°C; Termination: SMD/SMT; Depth: 1.25mm; Mount: Surface Mount; Thickness: 0.055inch; Max Operating Temperature: 125°C; Weight: 0.000335oz; Dielectric: X7R; Packaging: Tape and Reel
C53 C54 = CMP-2006-03040-2: as C78 on sheet 10_Control; Lead Free: Yes; Temperature Range High: +125°C; Temperature Characteristic: X7R; Device Class L2: Capacitors; Mouser Description: Multilayer Ceramic Capacitors MLCC - SMD/SMT 25volts 10000pF X7R 10%; ComponentLink2Description: Datasheet; Height: 0.87mm; Digikey Description: CAP CER 10000PF 25V 10% X7R 0603; ComponentLink2URL: https://api.kemet.com/component-edge/download/datasheet/C0603C100J5GACAUTO.pdf; Octopart: https://octopart.com/c0603c103k3ractu-kemet-89103; Category: Cap; Package: C0603C-CF; Voltage Rating: 25 V; Device Class L3: Ceramic Capacitors; Automotive: Yes; RoHS: TRUE; Temperature: -55°C to +125°C; Temperature Range Low: -55°C; Device Class L1: Passive Components; Manufacturer Part Number: C0603C103K3RACTU
C55 C56 = CMP-2006-02836-2: Chip Multilayer Ceramic Capacitors for General Purpose, 0603, 2.2uF, X7R, 15%, 10%, 10V; Case Code (Metric): 1608; Height: 0.8mm; Packaging: Cut Tape; Voltage: 10V; Lead Free: Lead Free; Min Operating Temperature: -55°C; Voltage Rating (DC): 10V; Max Operating Temperature: 125°C; Voltage Rating: 10V; Dielectric: X7R; Depth: 0.8mm; Case Code (Imperial): 0603; Termination: SMD/SMT; Case/Package: 0603; Number of Pins: 2; REACH SVHC: No SVHC; Mount: Surface Mount; Width: 0.031inch; Material: Ceramic; Capacitance: 2.2uF; Package Quantity: 1; Weight: 7.1E-05oz; Length: 1.6mm; Thickness: 0.035inch; Tolerance: 10%
J5-J7 = CMP-2000-05628-3: CONN HEADER VERT 2POS 1.25MM; Manufacturer: Molex; Conn Gender: Male; Voltage Rating: 125V; Conn Orientation: Vertical; Number Of Contacts: 2; Current Rating: 1A; Contact Material: Tin; Temperature Range Low: -40°C; ComponentLink2URL: http://www.molex.com/webdocs/datasheets/pdf/en-us/0530470210_PCB_HEADERS.pdf; Mouser Description: 1.25mm Pitch PicoBlade™ Wire-to-Board Header, Vertical, with Friction Lock, 2 Circuits; Manufacturer Part Number: 53047-0210; Temperature Range High: +85°C; ComponentLink2Description: Datasheet; Automotive: No; RoHS: TRUE; Ambient Temperature Range High: +85°C; Octopart: https://octopart.com/53047-0210-molex-276772; Footprint Url: https://www.molex.com/pdm_docs/sd/530470210_sd.pdf; Lead Free: Yes; Pitch: 1.25mm; Temperature: -40°C to +85°C; Device Class L2: Headers and Wire Housings; Package: 0; Ambient Temperature Range Low: -40°C; Digikey Description: CONN HEADER VERT 2POS 1.25MM; Category: Conn; Device Class L3: unset; Number Of Rows: 1; Device Class L1: Connectors; Height: 4.4mm
R24 R25 = CMP-1659-00055-2: RES SMD 47K OHM 1% 1/10W 0603; Voltage Rating: 50V; Temperature Coefficient: 100ppm/°C; Max Power Dissipation: 100mW; Resistance: 47kR; Voltage Rating (DC): 50V; Min Operating Temperature: -55°C; Packaging: Tape and Reel; Features: Moisture Resistant; Termination: SMD/SMT; Technology: THICK FILM; Lead Free: Lead Free; Max Operating Temperature: 155°C; Width: 0.031inch; Case Code (Metric): 1608; Tolerance: 1%; Package Quantity: 1; Resistor Type: Thick Film; RoHS Compliant: Yes; Case/Package: 0603; Case Code (Imperial): 0603; Resistance Tolerance: 1%; Length: 0.063inch; Series: RC; Number of Pins: 2; Power Rating: 100mW; Number of Terminations: 2; Construction: Rectangular; Height: 0.022inch; Military Standard: Not; Size Code: 0603; Depth: 0.8mm
R26 R27 = CMP-2100-03664-2: RES 10K OHM 1% 1/10W 0603; Voltage Rating: 75V; Voltage Rating (DC): 50V; Resistance: 10kR; Power Rating: 100mW; Temperature Coefficient: 100ppm/°C; Depth: 0.8mm; Termination: SMD/SMT; Resistor Type: Thick Film; Series: RC; Construction: Rectangular; Features: Moisture Resistant; Packaging: Tape and Reel; Min Operating Temperature: -55°C; Number of Terminations: 2; Lead Pitch: 0.3mm; RoHS Compliant: Yes; Case/Package: 0603; Resistance Tolerance: 1%; Military Standard: Not; Weight: 7.1E-05oz; Number of Pins: 2; Tolerance: 1%; Length: 1.6mm; Case Code (Imperial): 0603; Lead Free: Lead Free; Width: 0.8mm; Max Power Dissipation: 100mW; Height: 0.45mm; Max Operating Temperature: 155°C; Case Code (Metric): 1608; Size Code: 0603
R38-R40 = RL1206FR-070R4L: 400 mOhms Â±1% 0.25W, 1/4W Chip Resistor 1206 (3216 Metric) Automotive AEC-Q200, Current Sense, Moisture Resistant Thick Film; MF: Yageo; SnapEDA_Link: https://www.snapeda.com/parts/RL1206FR-070R4L/Yageo/view-part/?ref=snap; Package: 3116 Yageo; Value: *; MP: RL1206FR-070R4L; Check_prices: https://www.snapeda.com/parts/RL1206FR-070R4L/Yageo/view-part/?ref=eda
U9 U10 = CMP-1529-00004-3: IC MOTOR DRIVER PAR 16HTSSOP; Supply Current: 3mA; Max Output Current: 2A; Interface: PWM; Output Current: 1.5A; Max Supply Voltage: 10.8V; Fault Protection: Over Temperature; Number of Outputs: 2; Min Supply Voltage: 2.7V; Nominal Supply Current: 3mA; Series: DRV8833; Min Operating Temperature: -40°C; Package Quantity: 2000; Packaging: Tape and Reel; Case/Package: HTSSOP; Output Current per Channel: 1.5A; RoHS Compliant: Yes; RMS Current (Irms): 1.5A; Max Operating Temperature: 85°C; Technology: NMOS; Number of Pins: 16; Radiation Hardening: No; Lead Free: Lead Free; REACH SVHC: No SVHC

## Sheet 40_CANFD.SchDoc
size A4; SheetNumber: 9; SheetTotal: 16
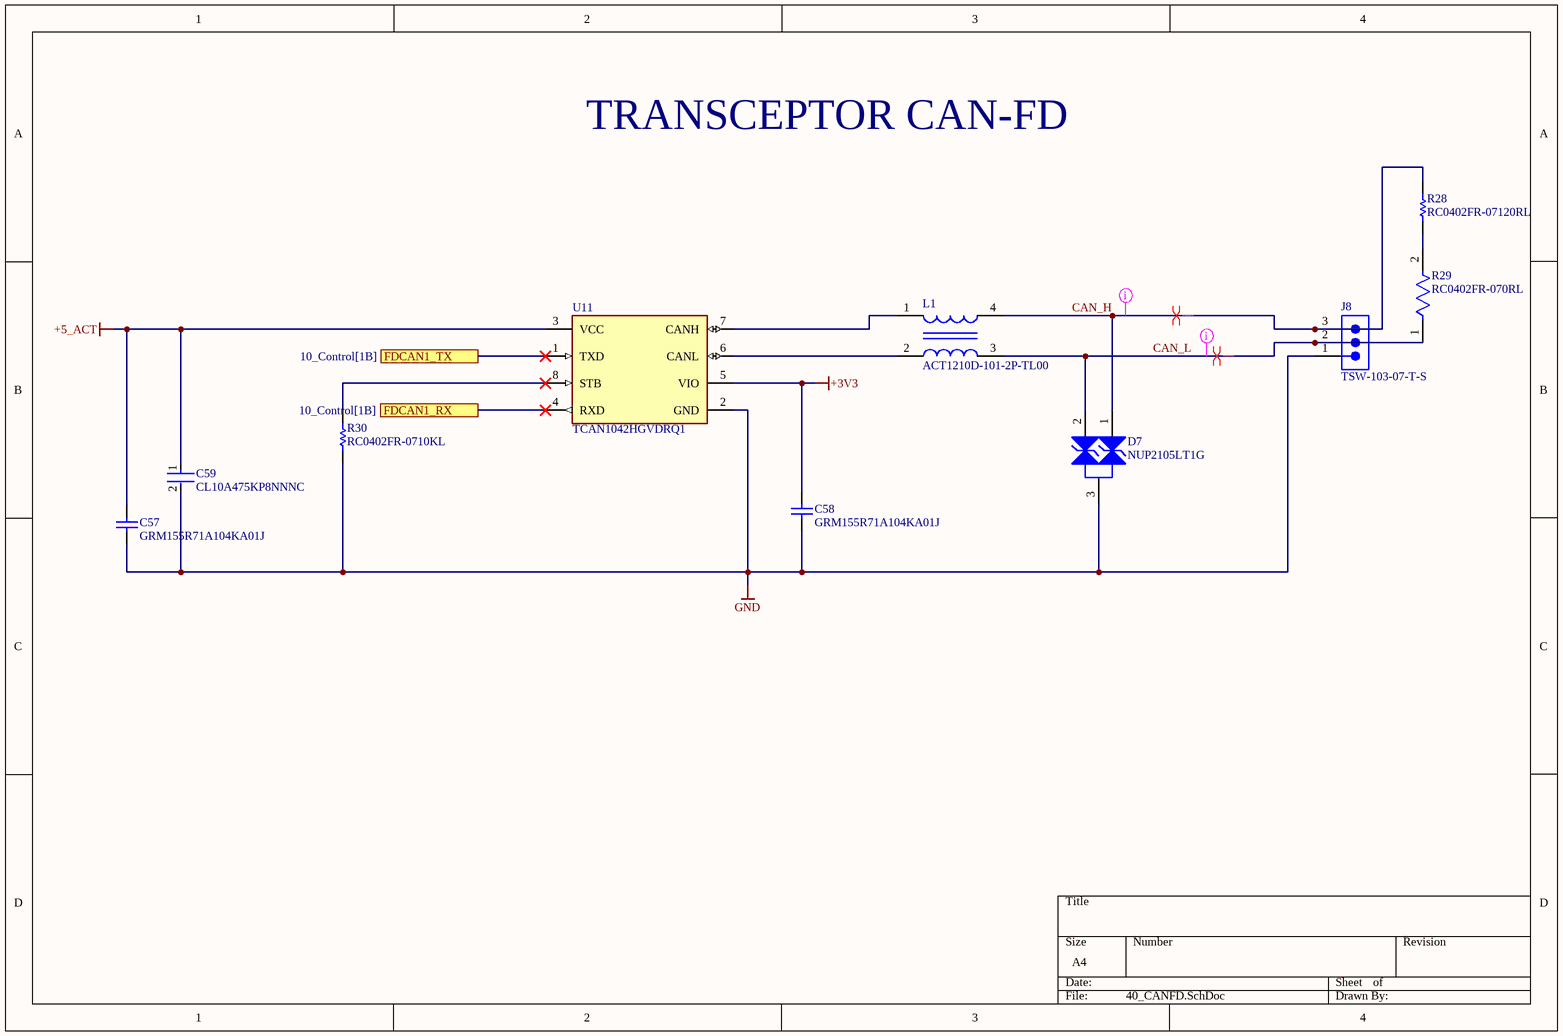
[diagram p9: 40_CANFD.SchDoc]

### Parts
C57  GRM155R71A104KA01J  [CAPC1005X55X25ML05T10]
C58  GRM155R71A104KA01J  [CAPC1005X55X25ML05T10]
C59  CL10A475KP8NNNC  [FP-CL10-IPC_C]
D7  NUP2105LT1G  [ONSC-SOT-23-3-318-08_V]
J8  TSW-103-07-T-S  [SMTC-TSW-103-07-X-S]
L1  ACT1210D-101-2P-TL00  [FP-ACT1210D-MFG]
R28  RC0402FR-07120RL  [RESC1005X40X25NL05T10]
R29  RC0402FR-070RL  [FP-RC0402-0_4-IPC_A]
R30  RC0402FR-0710KL  [RESC1005X40X25LL05T10]
U11  TCAN1042HGVDRQ1  [FP-D0008B-IPC_A]

### Ports
FDCAN1_RX (see 10_Control[1B]), FDCAN1_TX (see 10_Control[1B])

### Nets
+3V3: C58.2 U11.5(VIO)
+5_ACT: C57.2 C59.1 U11.3(VCC)
GND: C57.1 C58.1 C59.2 D7.3(K) J8.1 R30.1 U11.2(GND)
CAN_H: D7.1(K) J8.3 L1.4 R28.2
CAN_L: D7.2(K) J8.2 L1.3 R29.1
NetL1_1: L1.1 U11.7(CANH)
NetL1_2: L1.2 U11.6(CANL)
NetR28_1: R28.1 R29.2
NetR30_2: R30.2 U11.8(STB)
NetU1_45: U11.4(RXD) ; port FDCAN1_RX
NetU1_46: U11.1(TXD) ; port FDCAN1_TX

### Layout directives
net class CANFD_BUS: CAN_H, CAN_L
differential pair; differential pair class *: CAN_H
differential pair: CAN_L

### Notes on the sheet
- TRANSCEPTOR CAN-FD

### Library data of the parts
C57 C58 = CMP-2008-04031-1: Manufacturer: Murata; Part Number: GRM155R71A104KA01J
C59 = CMP-13271-003017-1: Cap Ceramic 4.7uF 10V X5R ±10% Pad SMD 0603 +85°C T/R; Capacitance: 4.7uF; Case/Package: 0603; Packaging: Tape and Reel; Width: 0.031inch; Contact Plating: Tin; Thickness: 0.035inch; Package Quantity: 1; Voltage Rating: 10V; Case Code (Metric): 1608; Case Code (Imperial): 0603; Depth: 0.8mm; Height: 0.8mm; Tolerance: 10%; Max Operating Temperature: 85°C; Length: 1.6mm; Dielectric: X5R; Mount: Surface Mount; Radiation Hardening: No; Min Operating Temperature: -55°C
D7 = CMP-1063-00164-1: Dual Line CAN Bus Protector, 3-Pin SOT-23, Pb-Free, Tape and Reel; Manufacturer: On Semiconductor; IR Max (uA): 0.1; Number of Lines: 2; Direction: Bidirectional; C Max (pF): 30; PPK Max (W): 350; V(BR) Min (V): 26.2; ComponentLink3URL: http://www.onsemi.cn/pub_link/Collateral/318-08.PDF; Mounting Technology: Surface Mount; ComponentLink2Description: Datasheet; PartNumber: NUP2105LT1G; ComponentLink1URL: http://www.onsemi.com/; PackageVersion: Rev. AP, 11/2009; DatasheetVersion: Rev. 5; RoHS: Pb-Free; PackageReference: SOT-23-3-318-08; ComponentLink2URL: http://www.onsemi.cn/pub_link/Collateral/NUP2105L-D.PDF; ComponentLink1Description: Manufacturer URL; PackageDescription: 3-Pin Small Outline Transistor, Body 2.92 x 1.3 mm, Pitch 0.95 mm; Packing: Tape and Reel; ComponentLink3Description: Package Specification
J8 = CMP-1024-00332-1: 0.025" SQ Post Header, Through-hole, Vertical, -55 to 105 degC, 2.54 mm Pitch, 3-Pin, Male, RoHS; Manufacturer: Samtec; Pitch: 2.54 mm; ComponentLink1URL: http://www.samtec.com; ComponentLink3URL: http://www.samtec.com/documents/webfiles/cpdf/TSW-XXX-XX-XXX-X-XX-XXX-MKT.pdf; PartNumber: TSW-103-07-T-S; Mounting Technology: Through-hole; RoHS: True; DatasheetVersion: F-214; PackageVersion: DM, 8/1988; Temperature Range: -55 to 105 degC; ComponentLink2Description: Datasheet; ComponentLink1Description: Manufacturer URL; Orientation: Vertical; PackageReference: TSW-103-07-X-S; ComponentLink3Description: Package Specification; ComponentLink2URL: http://www.samtec.com/documents/webfiles/pdf/TSW_TH.PDF; PackageDescription: .025[0.64] SQ. Post Terminal Strip Assembly
L1 = CMP-08256-000008-1: CMC 100UH 150MA 2LN SMD AEC-Q200
R28 = CMP-2002-07370-1: Manufacturer: Yageo / Phycomp; Part Number: RC0402FR-07120RL
R29 = CMP-2002-07342-2: RES SMD 0 OHM JUMPER 1/16W 0402; Resistance: 0R; Temperature Coefficient: 200ppm/°C; Tolerance: 1%; Power Rating: 62.5mW; Voltage Rating: 50V; Max Power Dissipation: 63mW; Features: Moisture Resistant; Length: 1mm; Case Code (Metric): 1005; Series: RC; RoHS Compliant: Yes; Resistor Type: Thick Film; Height: 0.35mm; Min Operating Temperature: -55°C; Case Code (Imperial): 0402; Number of Terminations: 2; Contact Plating: Tin; Case/Package: 0402; Size Code: 0402; Termination: SMD/SMT; Max Operating Temperature: 155°C; Width: 0.5mm; Mount: Surface Mount; Lead Free: Lead Free; Packaging: Tape and Reel; Radiation Hardening: No
R30 = CMP-2002-07353-1: Manufacturer: Yageo / Phycomp; Part Number: RC0402FR-0710KL
U11 = CMP-04872-000094-1: IC TRANSCEIVER 1/1 8SOIC; Max Supply Voltage: 5.5V; Number of Transmit Buffers: 1; Min Supply Voltage: 4.5V; Receiver Hysteresis: 120mV; Data Rate: 5Mbps; Mount: Surface Mount; Number of Pins: 8; Lead Free: Lead Free; Case/Package: SOIC; Min Operating Temperature: -55°C; RoHS Compliant: Yes; Max Operating Temperature: 125°C; Packaging: Cut Tape; Number of Receive Buffers: 1; REACH SVHC: No SVHC

## Sheet 50_POWER.SchDoc
size A4; SheetNumber: 6; SheetTotal: 6
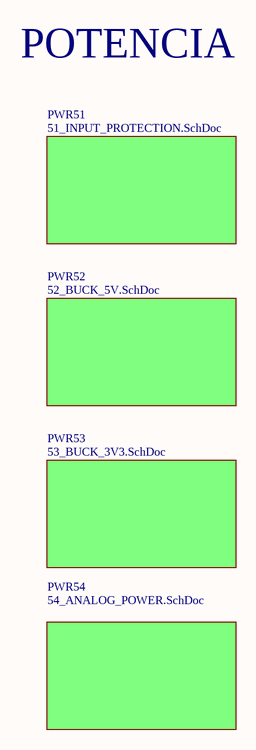
[diagram p10: 50_POWER.SchDoc]

### Sub-sheets
PWR51 = 51_INPUT_PROTECTION.SchDoc: no entries
PWR52 = 52_BUCK_5V.SchDoc: no entries
PWR53 = 53_BUCK_3V3.SchDoc: no entries
PWR54 = 54_ANALOG_POWER.SchDoc: no entries

### Notes on the sheet
- POTENCIA

## Sheet 51_INPUT_PROTECTION.SchDoc
size A4; SheetNumber: 11; SheetTotal: 16
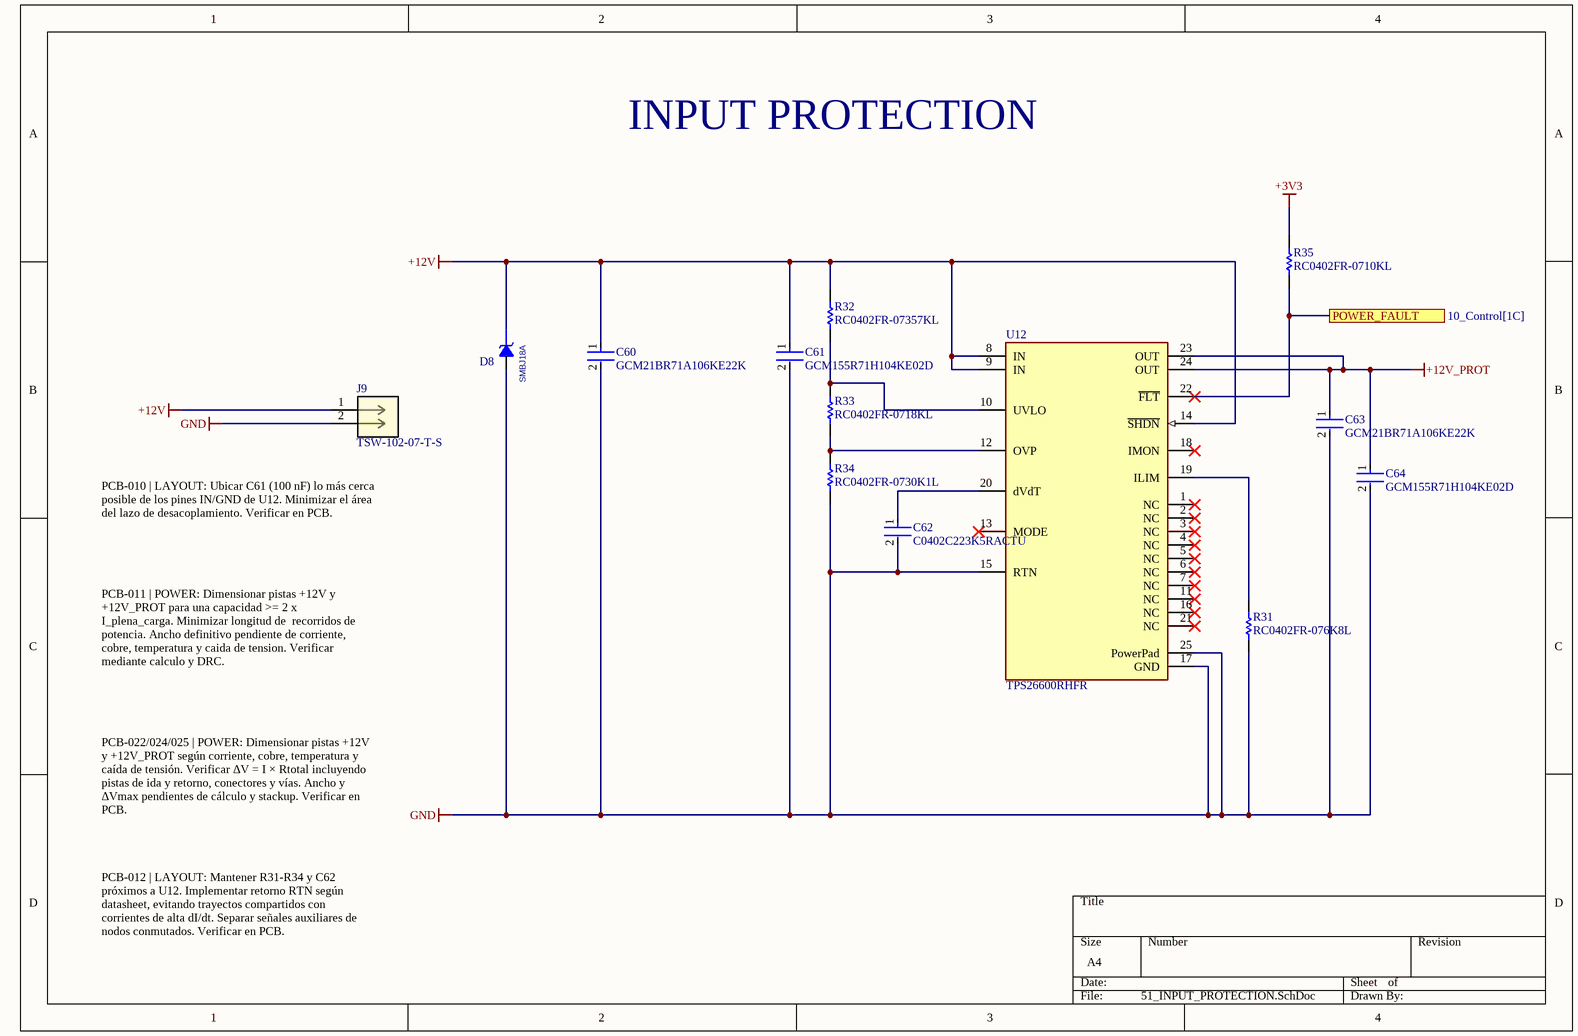
[diagram p11: 51_INPUT_PROTECTION.SchDoc]

### Parts
C60  GCM21BR71A106KE22K  [FP-GCM21B-0_15-MFG]
C61  GCM155R71H104KE02D  [FP-GCM155-0_05-IPC_A]
C62  C0402C223K5RACTU  [FP-C0402-BB-MFG]
C63  GCM21BR71A106KE22K  [FP-GCM21B-0_15-MFG]
C64  GCM155R71H104KE02D  [FP-GCM155-0_05-IPC_A]
D8  SMBJ18A  [ST_SMB]
J9  TSW-102-07-T-S  [CON2_1X2_TU_TSW]
R31  RC0402FR-076K8L  [RESC1005X40X25ML05T10]
R32  RC0402FR-07357KL  [RESC1005X40X25LL05T10]
R33  RC0402FR-0718KL  [RESC1005X40X25LL05T10]
R34  RC0402FR-0730K1L  [RESC1005X40X25NL05T10]
R35  RC0402FR-0710KL  [RESC1005X40X25LL05T10]
U12  TPS26600RHFR  [FP-RHF0024A-IPC_A]

### Ports
POWER_FAULT (see 10_Control[1C])

### Nets
+3V3: R35.2
+12V: C60.1 C61.1 D8.1(K) J9.1 R32.2 U12.8(IN) U12.9(IN) U12.14(~{SHDN})
+12V_PROT: C63.1 C64.1 U12.23(OUT) U12.24(OUT)
GND: C60.2 C61.2 C62.2 C63.2 C64.2 D8.2(A) J9.2 R31.1 R34.1 U12.15(RTN) U12.17(GND) U12.25(PowerPad)
NetC62_1: C62.1 U12.20(dVdT)
NetR31_2: R31.2 U12.19(ILIM)
NetR32_1: R32.1 R33.2 U12.10(UVLO)
NetR33_1: R33.1 R34.2 U12.12(OVP)
NetR35_1: R35.1 U12.22(~{FLT}) ; port POWER_FAULT

Not connected (* = marked no-connect by the designer): U12 1(NC)* 2(NC)* 3(NC)* 4(NC)* 5(NC)* 6(NC)* 7(NC)* 11(NC)* 13(MODE)* 16(NC)* 18(IMON)* 21(NC)*

### Notes on the sheet
- INPUT PROTECTION
- PCB-010 | LAYOUT: Ubicar C61 (100 nF) lo más cerca posible de los pines IN/GND de U12. Minimizar el área del lazo de desacoplamiento. Verificar en PCB.
- PCB-011 | POWER: Dimensionar pistas +12V y +12V_PROT para una capacidad >= 2 x I_plena_carga. Minimizar longitud de  recorridos de potencia. Ancho definitivo pendiente de corriente, cobre, temperatura y caida de tension. Verificar mediante calculo y DRC.
- PCB-022/024/025 | POWER: Dimensionar pistas +12V y +12V_PROT según corriente, cobre, temperatura y caída de tensión. Verificar ΔV = I × Rtotal incluyendo pistas de ida y retorno, conectores y vías. Ancho y ΔVmax pendientes de cálculo y stackup. Verificar en PCB.
- PCB-012 | LAYOUT: Mantener R31-R34 y C62 próximos a U12. Implementar retorno RTN según datasheet, evitando trayectos compartidos con corrientes de alta dI/dt. Separar señales auxiliares de nodos conmutados. Verificar en PCB.

### Library data of the parts
C60 C63 = CMP-06035-062139-1: as C17 on sheet 22_Magnetometro; Mount: Surface Mount; Max Operating Temperature: 125°C; Tolerance: 10%; Voltage Rating (DC): 10V; Dielectric: X7R; RoHS Compliant: Yes; Package Quantity: 10000; Min Operating Temperature: -55°C; Case/Package: 0805; Case Code (Imperial): 0805; Thickness: 0.055inch; Weight: 0.000335oz; Length: 0.079inch; Ratings: AEC-Q200; Case Code (Metric): 2012; Termination: SMD/SMT; Width: 1.25mm; Height: 1.25mm; Packaging: Tape and Reel; Capacitance: 10uF
C61 C64 = CMP-2000-07456-3: Ceramic Capacitor for Automotive 100nF ±10% 50VDC X7R 0402 Paper T/R; Voltage Rating (DC): 50V; Capacitance: 100nF; Package Quantity: 10000; Tolerance: 10%; Height: 0.5mm; Mount: Surface Mount; Voltage Rating: 50V; Weight: 0.000212oz; Thickness: 0.022inch; Case Code (Imperial): 0402; Length: 0.039inch; Packaging: Tape and Reel; Case Code (Metric): 1005; Min Operating Temperature: -55°C; Termination: SMD/SMT; REACH SVHC: No SVHC; Max Operating Temperature: 125°C; Lead Free: Lead Free; Dielectric: X7R; Ratings: AEC-Q200; Width: 0.5mm; Case/Package: 0402
C62 = CMP-2008-03151-2: CAP CER 0.022UF 50V 10% X7R 0402; Manufacturer: Kemet; Tolerance: 0.1; Temperature Coefficient: 15%; Capacitance: 22,000 pF; Material: Ceramic; Value: 22,000 pF; Lead Free: Yes; ComponentLink2URL: https://content.kemet.com/datasheets/KEM_C1002_X7R_SMD.pdf; Category: Cap; Digikey Description: CAP CER 0.022UF 50V 10% X7R 0402; Manufacturer Part Number: C0402C223K5RACTU; Mouser Description: 0402 C 22nF Ceramic Multilayer Capacitor, 50 V, +125degC, X7R Dielectric, +/-10%; Temperature: -55°C to +125°C; Temperature Range High: +125°C; Device Class L3: Ceramic Capacitors; Device Class L1: Passive Components; Height: 0.55mm; Package: C0402-BB; Octopart: https://octopart.com/c0402c223k5ractu-kemet-99241; Temperature Range Low: -55°C; Voltage Rating: 50 V; Ipc Land Pattern Name: CAPC10050X50; ComponentLink2Description: Datasheet; Automotive: No; Temperature Characteristic: X7R; RoHS: TRUE; Device Class L2: Capacitors
J9 = TSW-102-07-T-S: Description; Manufacturer_Name: Samtec Inc; Copyright: Copyright (C) 2025 Ultra Librarian. All rights reserved.; Manufacturer_Part_Number: TSW-102-07-T-S; RefDes: RefDes; Type: Type
R31 = CMP-2002-07004-1: Manufacturer: Yageo / Phycomp; Part Number: RC0402FR-076K8L
R32 = CMP-2002-07627-1: Manufacturer: Yageo / Phycomp; Part Number: RC0402FR-07357KL
R33 = CMP-1011-00650-2: Manufacturer: Yageo / Phycomp; Part Number: RC0402FR-0718KL
R34 = CMP-2002-07600-1: Manufacturer: Yageo / Phycomp; Part Number: RC0402FR-0730K1L
R35 = CMP-2002-07353-1: Manufacturer: Yageo / Phycomp; Part Number: RC0402FR-0710KL
U12 = CMP-04913-000047-1: IC PWR MGMT EFUSE 60V 24VQFN; Number of Channels: 1; Accuracy: 5%; Output Current: 2.35A; Min Operating Temperature: -40°C; RoHS Compliant: Yes; Case/Package: VQFN; Max Operating Temperature: 125°C; Mount: Surface Mount; Packaging: Cut Tape